# EAGLE schematic RK628H-30P-RevA (EAGLE 9.7.0)

## Sheet 1 of 7: Title Page
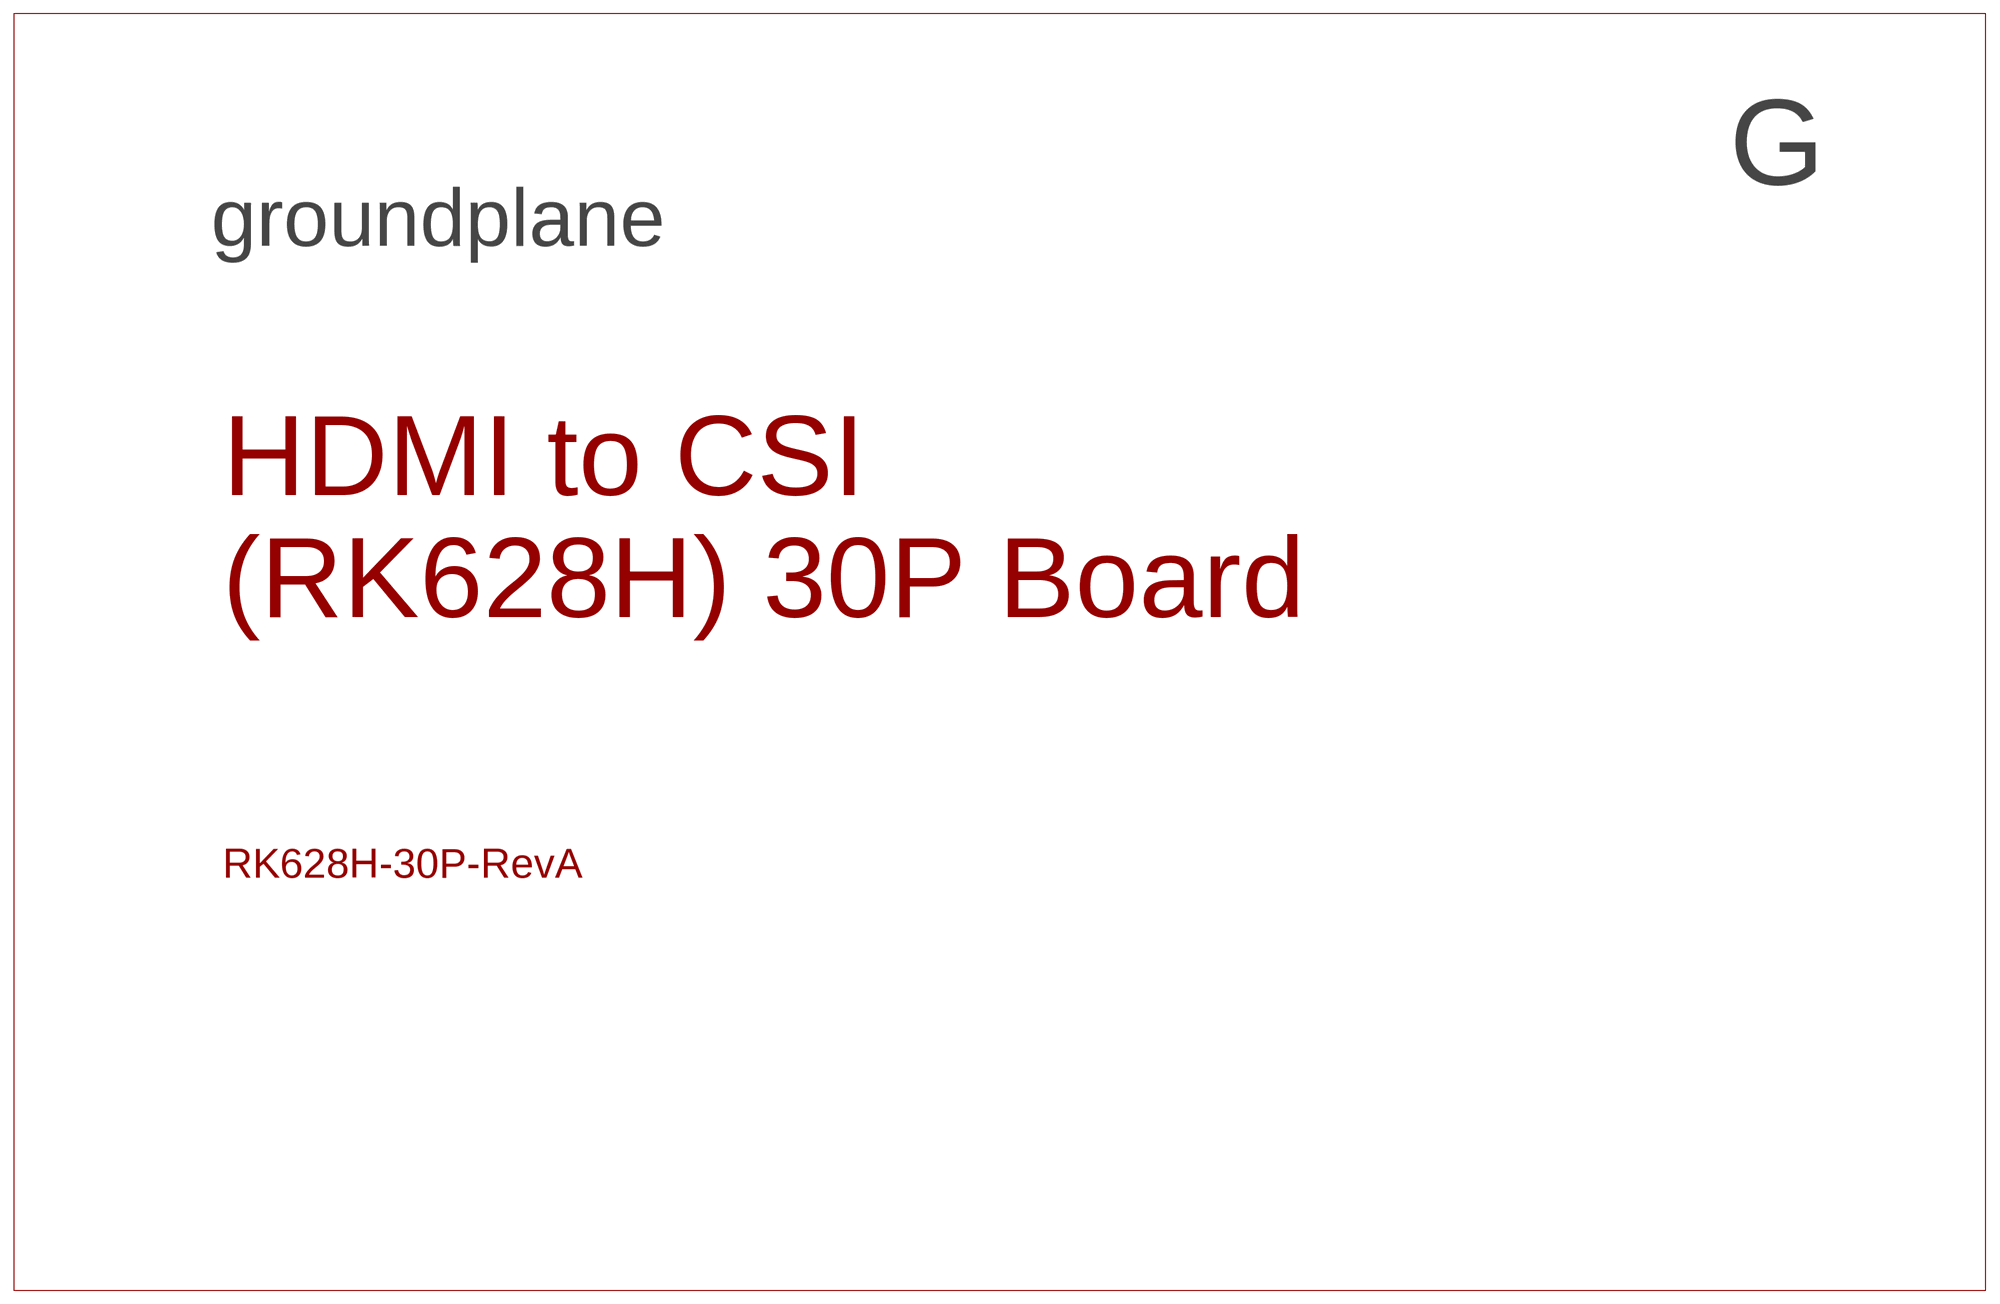
[diagram p0: schematic, sheet 1]

### Notes on the sheet
- HDMI to CSI 
  (RK628H) 30P Board

## Sheet 2 of 7: Table of Contents
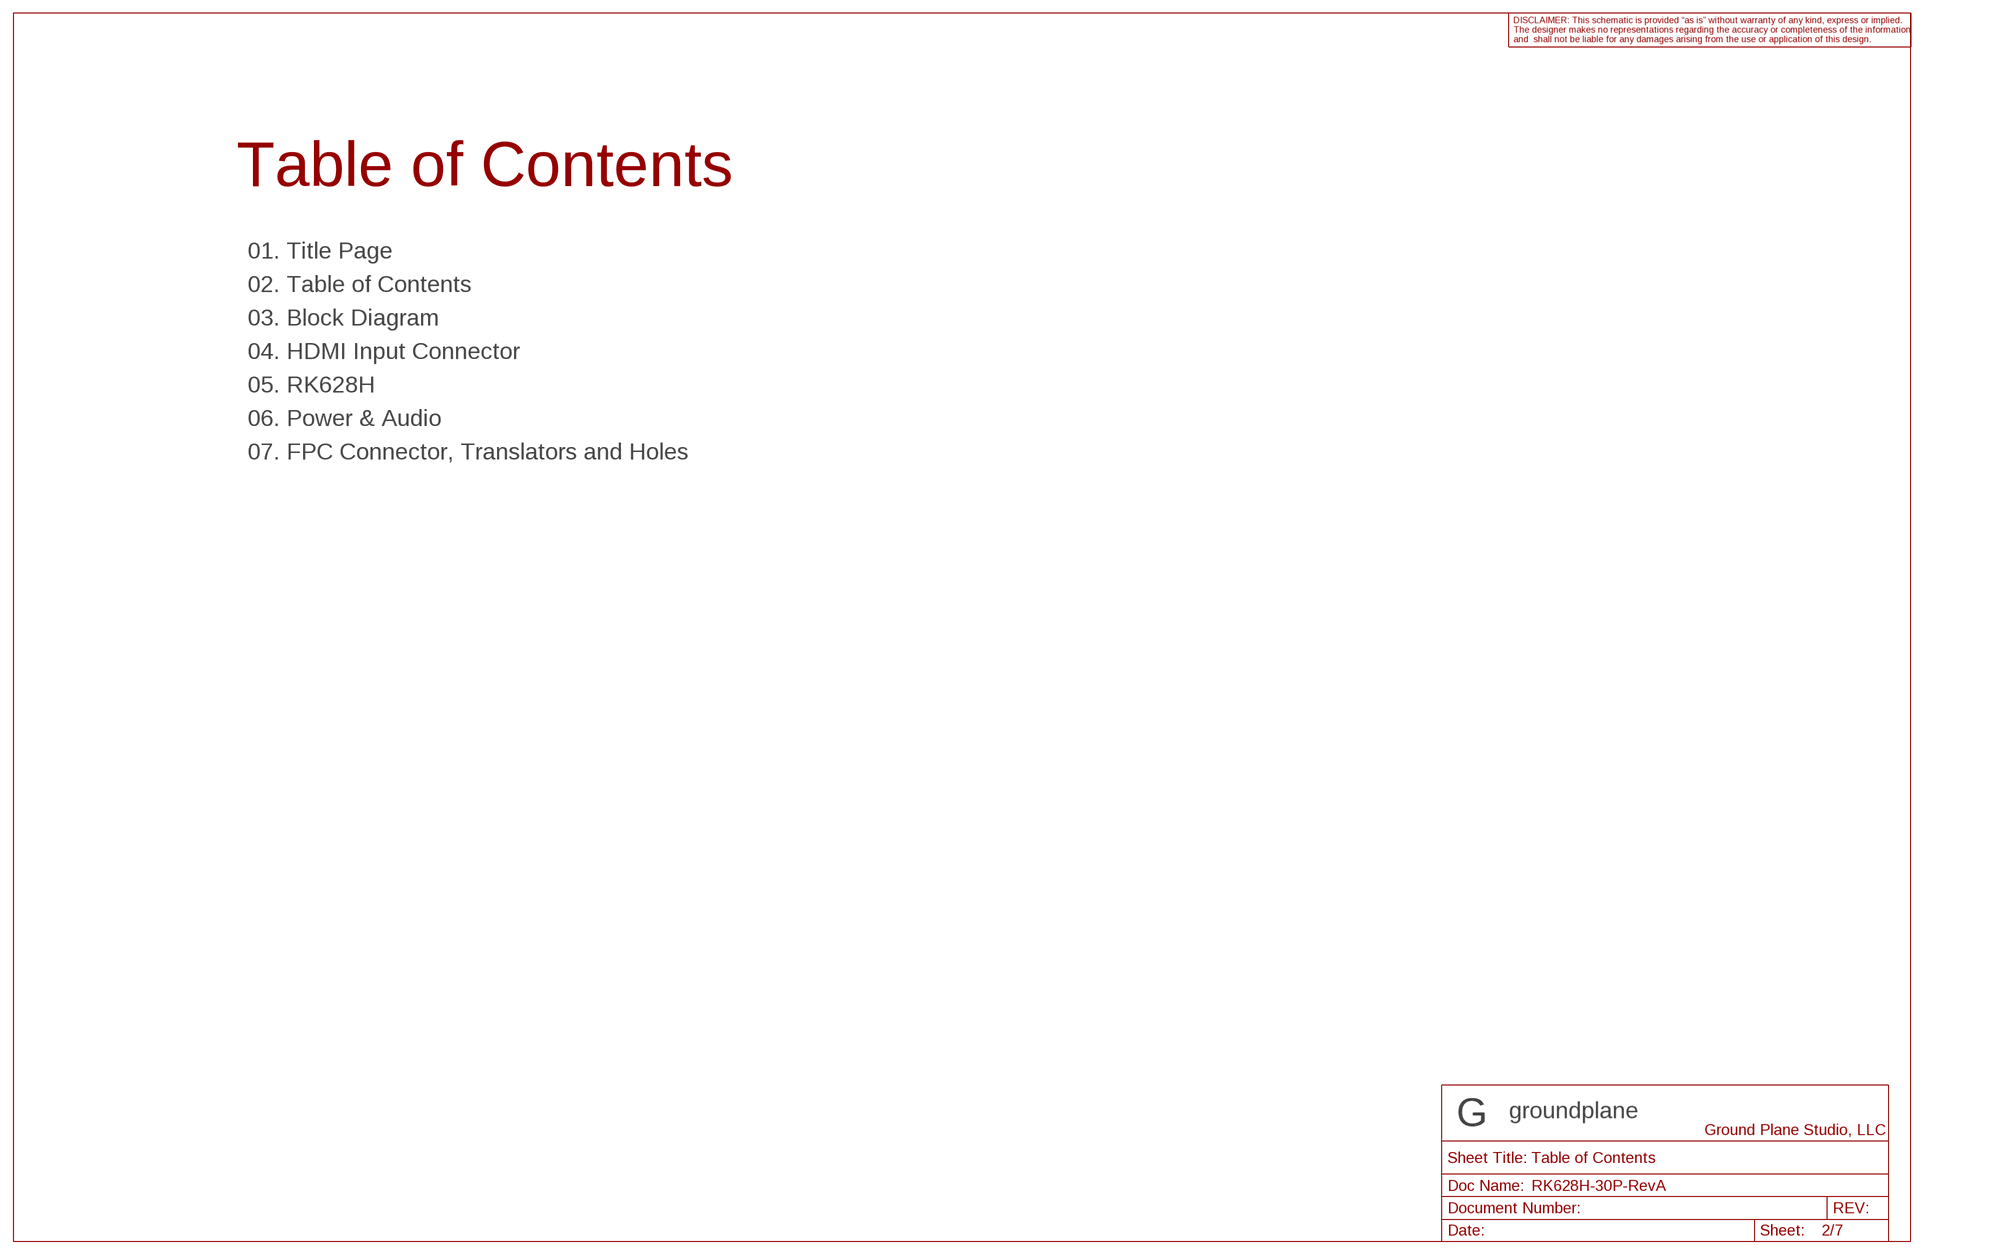
[diagram p1: schematic, sheet 2]

### Notes on the sheet
- 01. Title Page
- 02. Table of Contents
- 03. Block Diagram
- 04. HDMI Input Connector
- 05. RK628H
- 06. Power & Audio
- 07. FPC Connector, Translators and Holes

## Sheet 3 of 7: Block Diagram
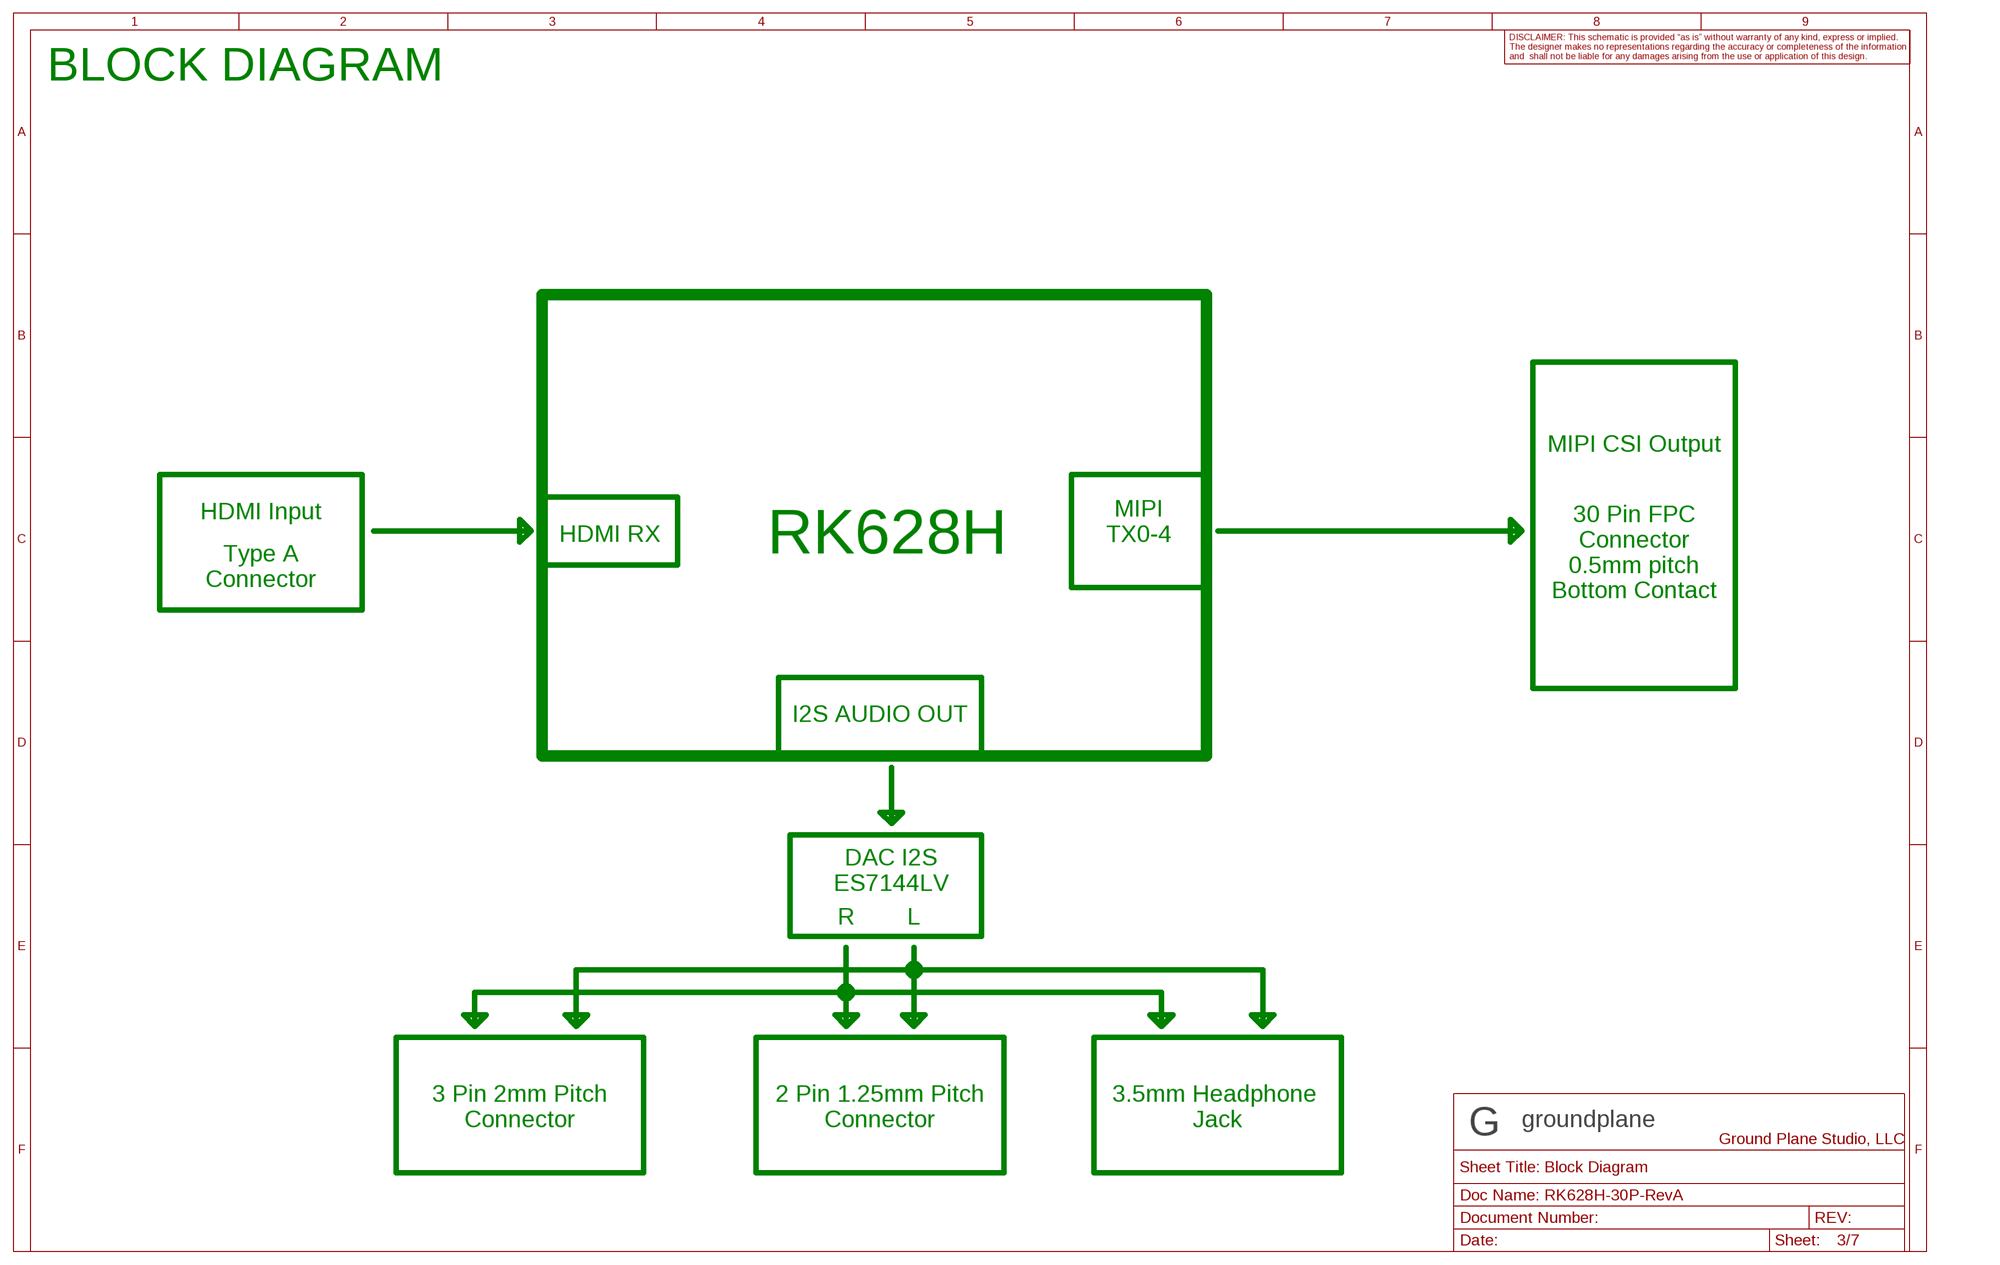
[diagram p2: schematic, sheet 3]

### Notes on the sheet
- BLOCK DIAGRAM
- MIPI CSI Output
- HDMI Input
- HDMI RX
- MIPI
  TX0-4
- RK628H
- Type A
  Connector
- 30 Pin FPC
  Connector
  0.5mm pitch
  Bottom Contact
- I2S AUDIO OUT
- DAC I2S
  ES7144LV
- R | L
- 3 Pin 2mm Pitch
  Connector
- 2 Pin 1.25mm Pitch
  Connector
- 3.5mm Headphone 
  Jack

## Sheet 4 of 7: HDMI Input Connector/TVS/Filters
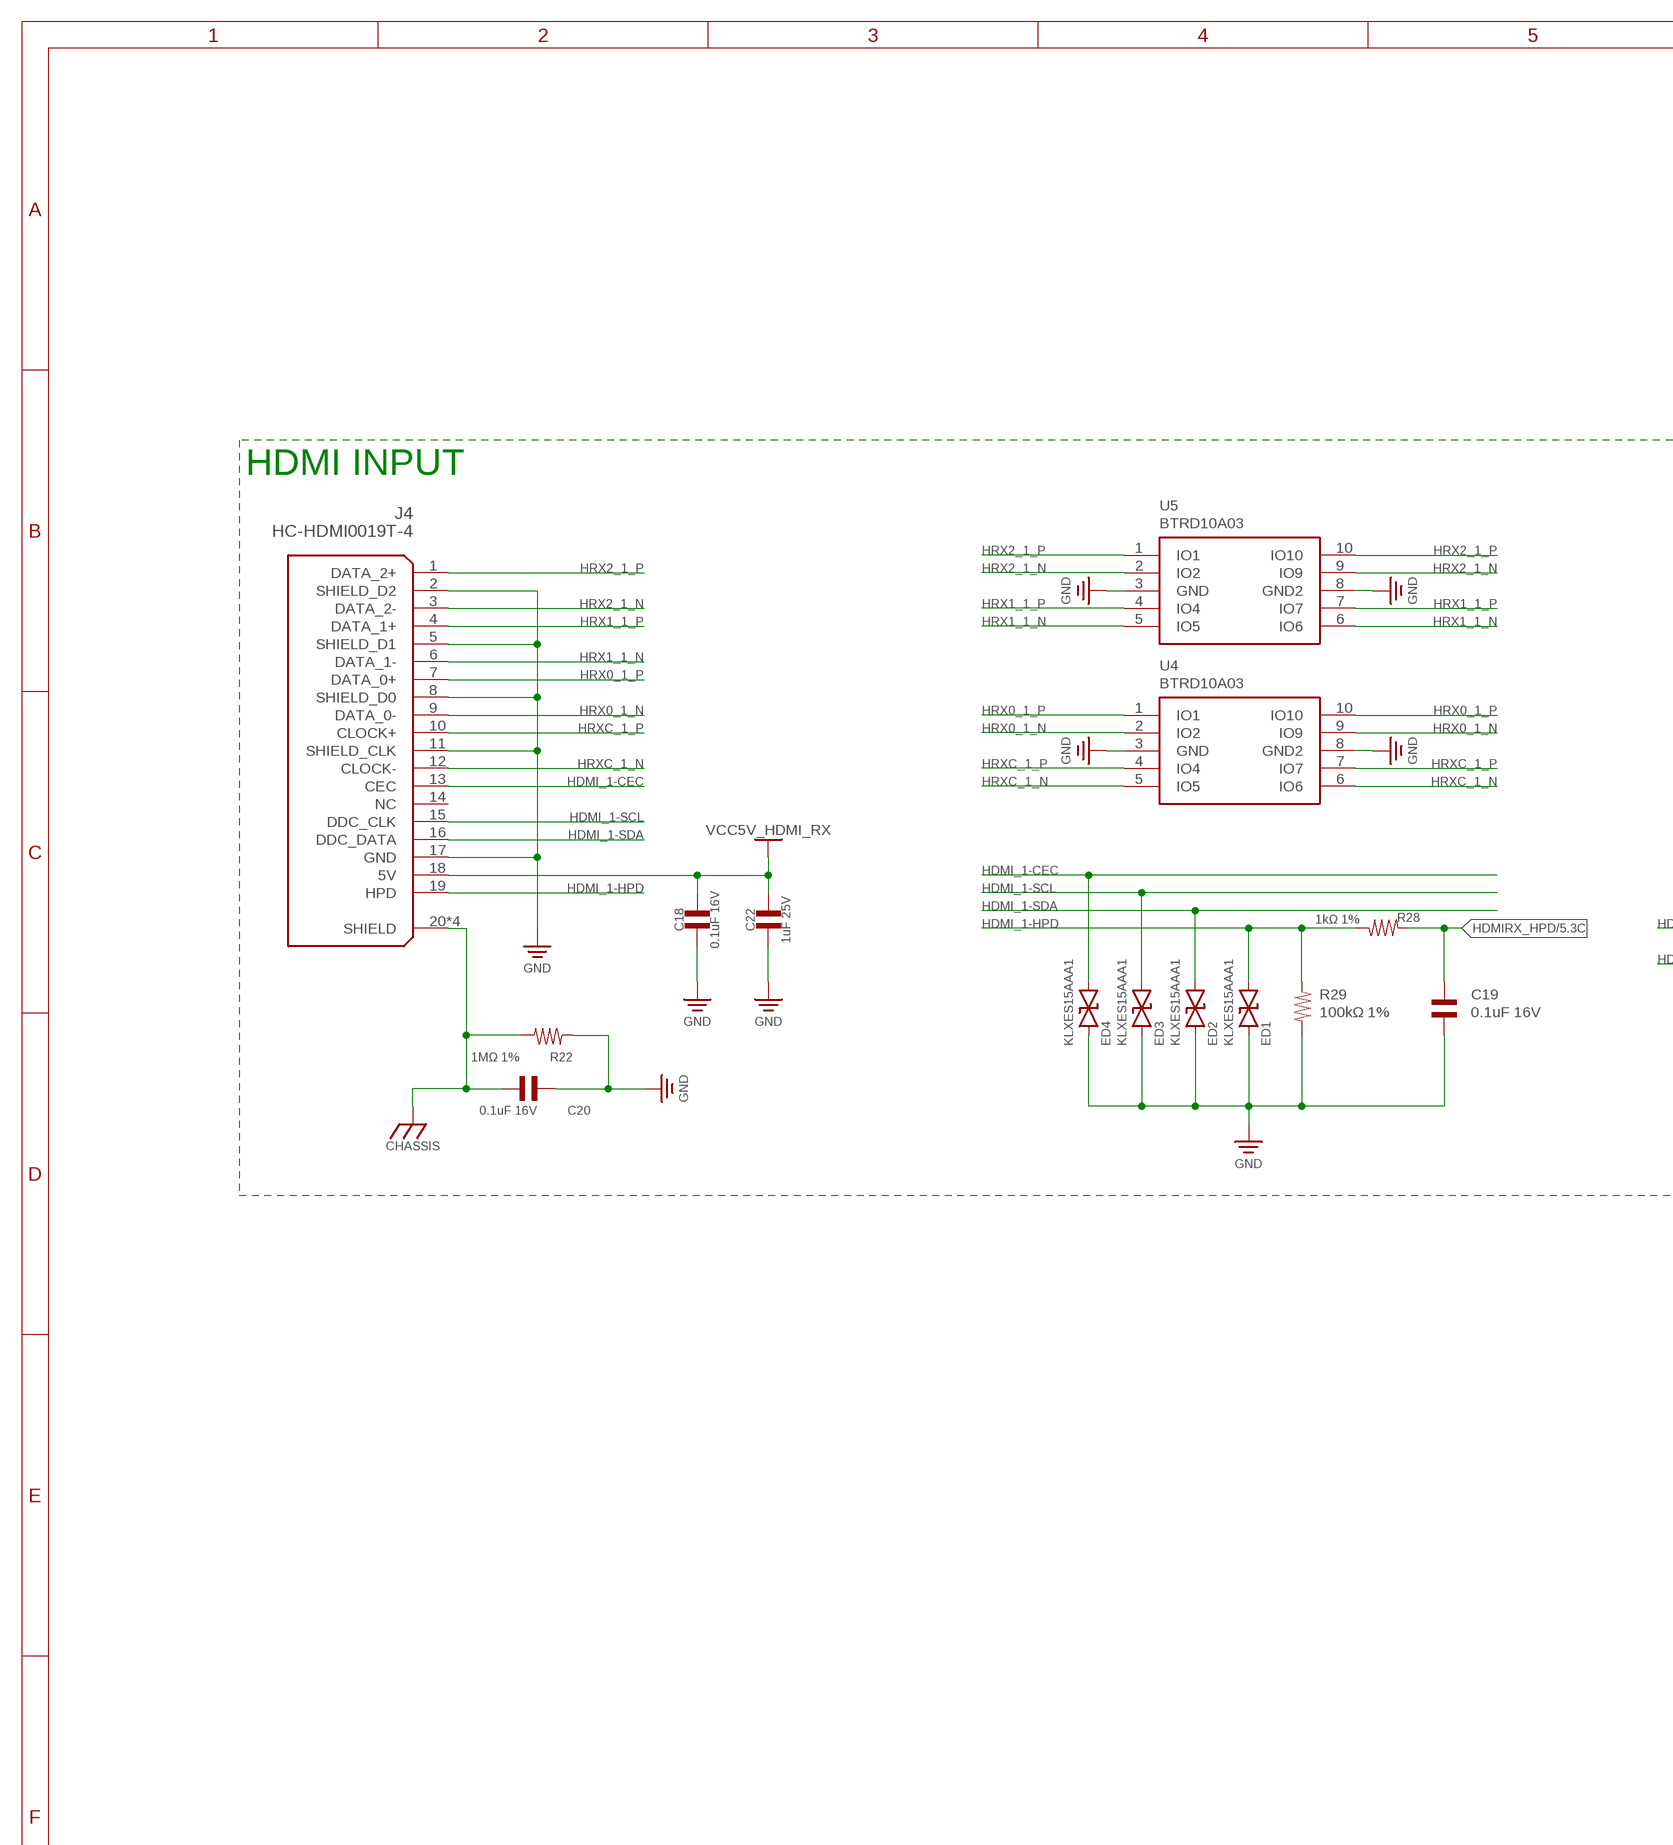
[diagram p3: schematic, sheet 4, part 1 of 2]
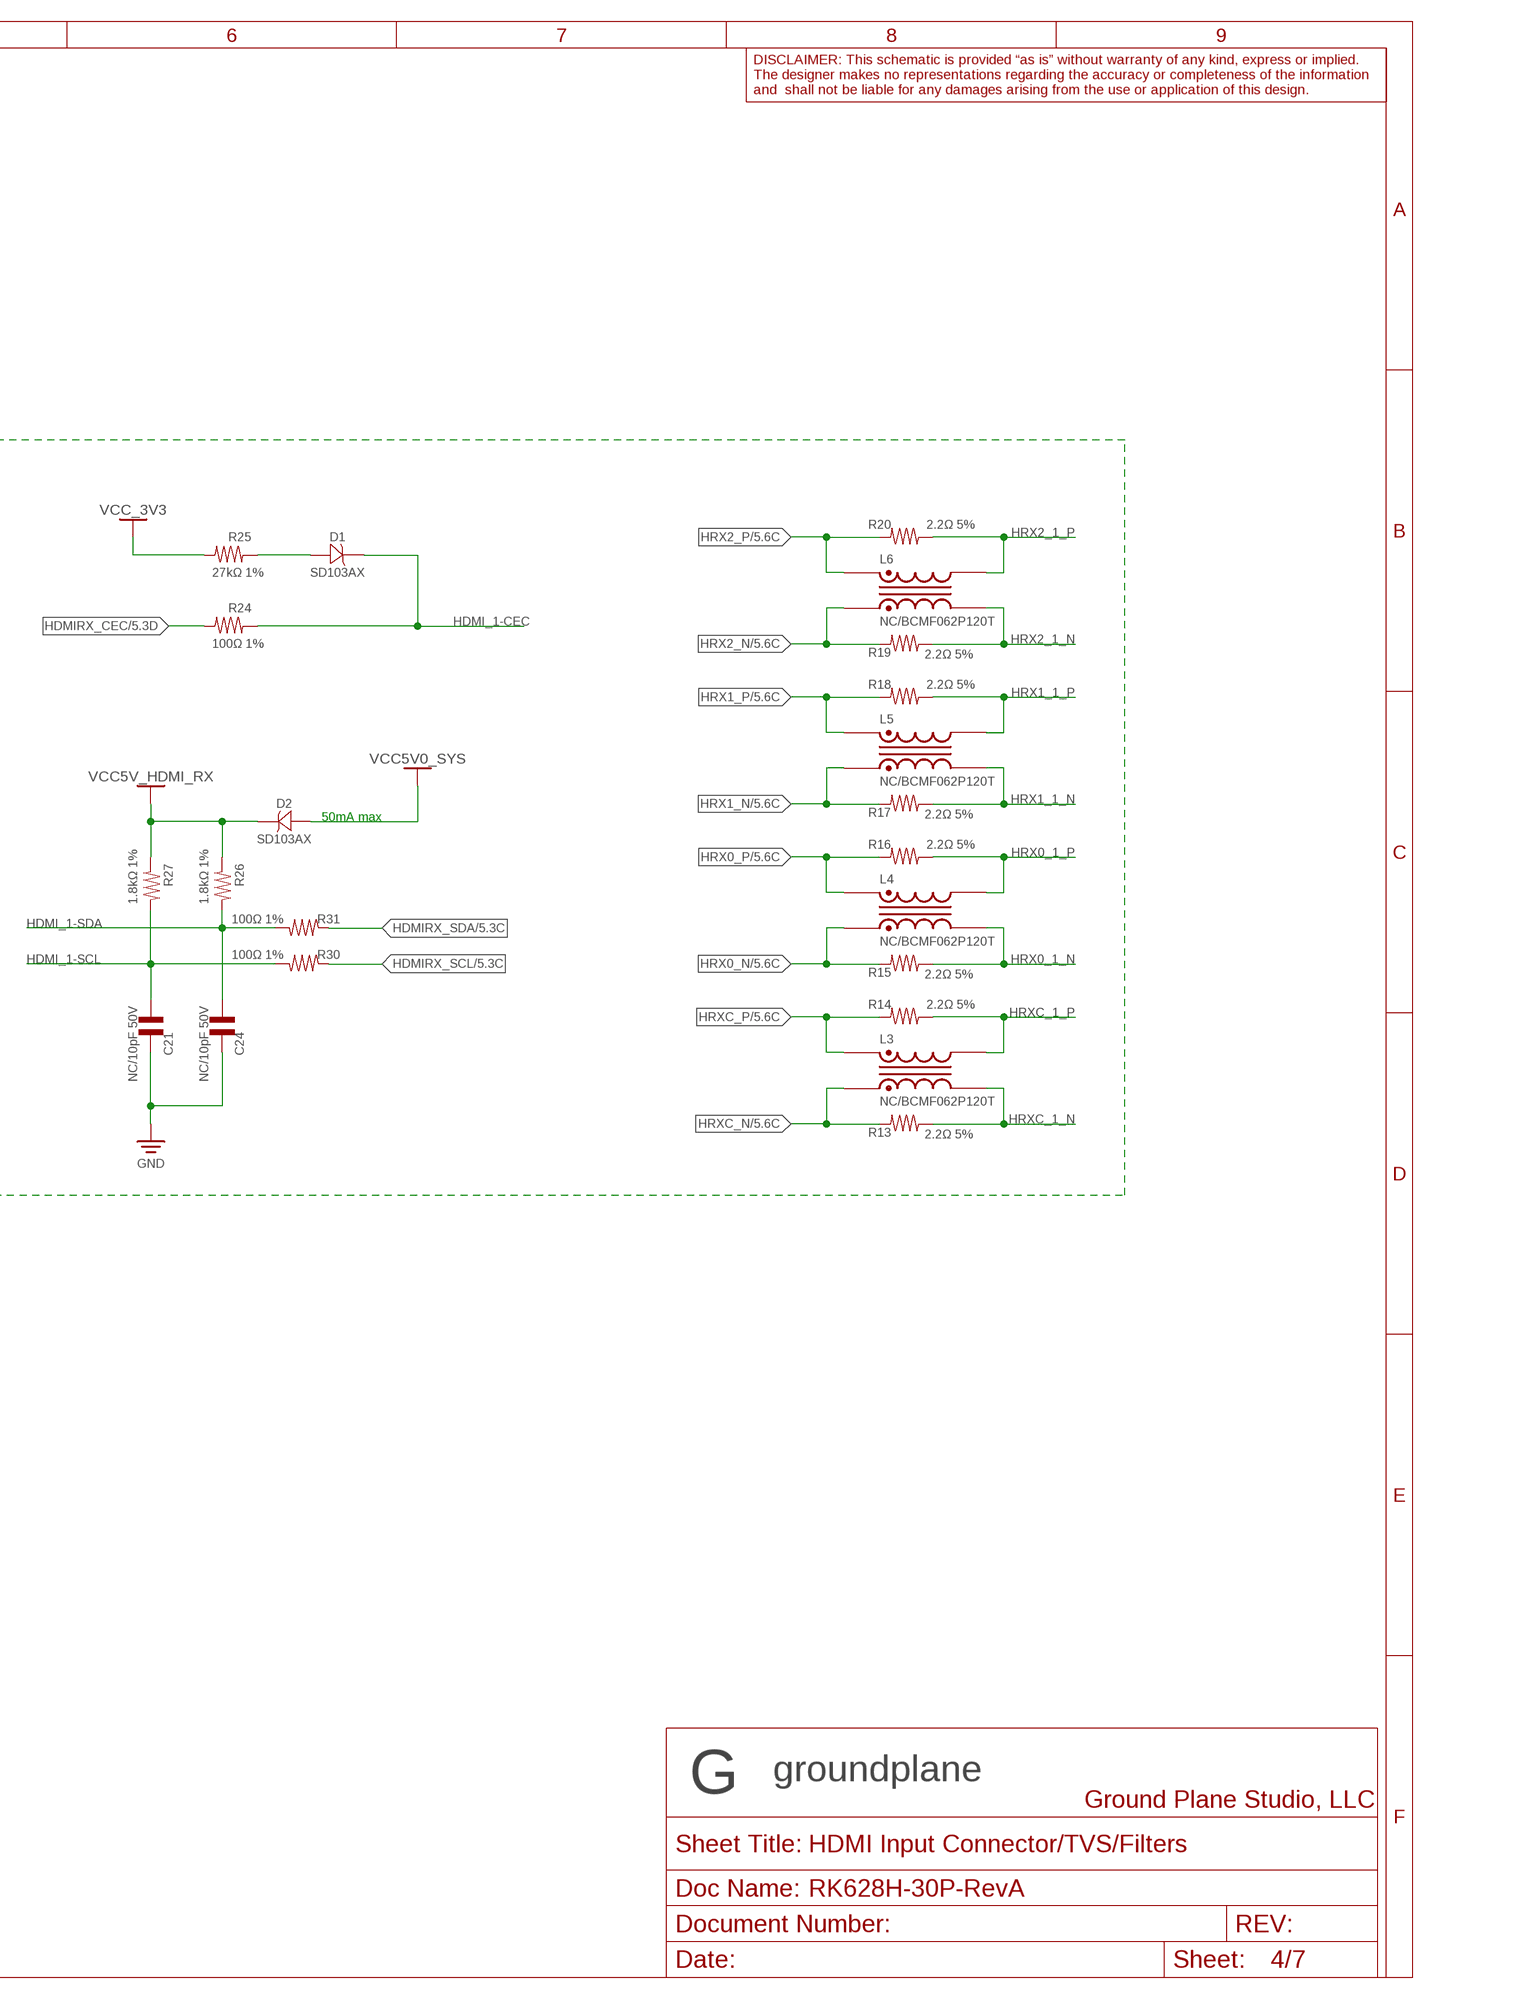
[diagram p4: schematic, sheet 4, part 2 of 2]

### Parts
C18  0.1uF 16V  CAP_0402_0.1UF_16V_X7R  [CAP_0402]
C19  0.1uF 16V  CAP_0402_0.1UF_16V_X7R  [CAP_0402]
C20  0.1uF 16V  CAP_0402_0.1UF_16V_X7R  [CAP_0402]
C21  NC/10pF 50V  CAP_0201_DNP_10PF_50V  [CAP_0201]
C22  1uF 25V  CAP_0402_1UF_25V_X5R  [CAP_0402]
C24  NC/10pF 50V  CAP_0201_DNP_10PF_50V  [CAP_0201]
D1  SD103AX  [SD103AX]
D2  SD103AX  [SD103AX]
ED1  KLXES15AAA1  TVS_ESD_1CH_BI_KLXES15AAA1  [TVS_0402]
ED2  KLXES15AAA1  TVS_ESD_1CH_BI_KLXES15AAA1  [TVS_0402]
ED3  KLXES15AAA1  TVS_ESD_1CH_BI_KLXES15AAA1  [TVS_0402]
ED4  KLXES15AAA1  TVS_ESD_1CH_BI_KLXES15AAA1  [TVS_0402]
J4  HC-HDMI0019T-4  CONN_HDMI_A_HC-HDMI0019T-4  [CONN_HDMI_A_SMT_RA_HC-HDMI0019T-4]
L3  NC/BCMF062P120T  BCMF062P120T_BCMF062P120T_NC  [BCMF062P120T]
L4  NC/BCMF062P120T  BCMF062P120T_BCMF062P120T_NC  [BCMF062P120T]
L5  NC/BCMF062P120T  BCMF062P120T_BCMF062P120T_NC  [BCMF062P120T]
L6  NC/BCMF062P120T  BCMF062P120T_BCMF062P120T_NC  [BCMF062P120T]
R13  2.2Ω 5%  RES_0201_2R2_5%  [RES_0201]
R14  2.2Ω 5%  RES_0201_2R2_5%  [RES_0201]
R15  2.2Ω 5%  RES_0201_2R2_5%  [RES_0201]
R16  2.2Ω 5%  RES_0201_2R2_5%  [RES_0201]
R17  2.2Ω 5%  RES_0201_2R2_5%  [RES_0201]
R18  2.2Ω 5%  RES_0201_2R2_5%  [RES_0201]
R19  2.2Ω 5%  RES_0201_2R2_5%  [RES_0201]
R20  2.2Ω 5%  RES_0201_2R2_5%  [RES_0201]
R22  1MΩ 1%  RES_0402_1M_1%  [RES_0402]
R24  100Ω 1%  RES_0402_100R_1%  [RES_0402]
R25  27kΩ 1%  RES_0402_27K_1%  [RES_0402]
R26  1.8kΩ 1%  RES_0402_1K8_1%  [RES_0402]
R27  1.8kΩ 1%  RES_0402_1K8_1%  [RES_0402]
R28  1kΩ 1%  RES_0402_1K_1%  [RES_0402]
R29  100kΩ 1%  RES_0402_100K_1%_1/16W  [RES_0402]
R30  100Ω 1%  RES_0402_100R_1%  [RES_0402]
R31  100Ω 1%  RES_0402_100R_1%  [RES_0402]
U4  BTRD10A03  TVS_ESD_4CH_10P_PASS_THRU_BTRD10A03  [DFN2510-10]
U5  BTRD10A03  TVS_ESD_4CH_10P_PASS_THRU_BTRD10A03  [DFN2510-10]

### Nets
CGND: C20.2 J4.20(SHIELD) J4.21(SHIELD) J4.22(SHIELD) J4.23(SHIELD) R22.1 ; supply symbol labelled CHASSIS ; also sheet 7
GND: C18.1 C19.1 C20.1 C21.1 C22.1 C24.1 ED1.1 ED2.1 ED3.1 ED4.1 J4.2(SHIELD_D2) J4.5(SHIELD_D1) J4.8(SHIELD_D0) J4.11(SHIELD_CLK) J4.17(GND) R22.2 R29.1 U4.3(GND) U4.8(GND2) U5.3(GND) U5.8(GND2) ; also sheet 5,6,7
HDMI_1-CEC: D1.C ED4.2 J4.13(CEC) R24.1
HDMI_1-HPD: ED1.2 J4.19(HPD) R28.1 R29.2
HDMI_1-SCL: C21.2 ED3.2 J4.15(DDC_CLK) R27.2 R30.1
HDMI_1-SDA: C24.2 ED2.2 J4.16(DDC_DATA) R26.2 R31.1
HDMIRX_CEC: R24.2 ; also sheet 5
HDMIRX_HPD: C19.2 R28.2 ; also sheet 5
HDMIRX_SCL: R30.2 ; also sheet 5
HDMIRX_SDA: R31.2 ; also sheet 5
HRX0_1_N [hdmi_diff]: J4.9(DATA_0-) L4.3 R15.1 U4.2(IO2) U4.9(IO9)
HRX0_1_P [hdmi_diff]: J4.7(DATA_0+) L4.4 R16.1 U4.1(IO1) U4.10(IO10)
HRX0_N [hdmi_diff]: L4.2 R15.2 ; also sheet 5
HRX0_P [hdmi_diff]: L4.1 R16.2 ; also sheet 5
HRX1_1_N [hdmi_diff]: J4.6(DATA_1-) L5.3 R17.1 U5.5(IO5) U5.6(IO6)
HRX1_1_P [hdmi_diff]: J4.4(DATA_1+) L5.4 R18.1 U5.4(IO4) U5.7(IO7)
HRX1_N [hdmi_diff]: L5.2 R17.2 ; also sheet 5
HRX1_P [hdmi_diff]: L5.1 R18.2 ; also sheet 5
HRX2_1_N [hdmi_diff]: J4.3(DATA_2-) L6.3 R19.1 U5.2(IO2) U5.9(IO9)
HRX2_1_P [hdmi_diff]: J4.1(DATA_2+) L6.4 R20.1 U5.1(IO1) U5.10(IO10)
HRX2_N [hdmi_diff]: L6.2 R19.2 ; also sheet 5
HRX2_P [hdmi_diff]: L6.1 R20.2 ; also sheet 5
HRXC_1_N [hdmi_diff]: J4.12(CLOCK-) L3.3 R13.1 U4.5(IO5) U4.6(IO6)
HRXC_1_P [hdmi_diff]: J4.10(CLOCK+) L3.4 R14.1 U4.4(IO4) U4.7(IO7)
HRXC_N [hdmi_diff]: L3.2 R13.2 ; also sheet 5
HRXC_P [hdmi_diff]: L3.1 R14.2 ; also sheet 5
N$11: D1.A R25.1
VCC5V0_SYS: D2.A ; also sheet 6,7
VCC5V_HDMI_RX: C18.2 C22.2 D2.C J4.18(5V) R26.1 R27.1 ; also sheet 7
VCC_3V3: R25.2 ; also sheet 5,6,7
Unconnected: J4.14(NC)

### Notes on the sheet
- HDMI INPUT
- 50mA max

## Sheet 5 of 7: HDMI TO CSI - RK628H
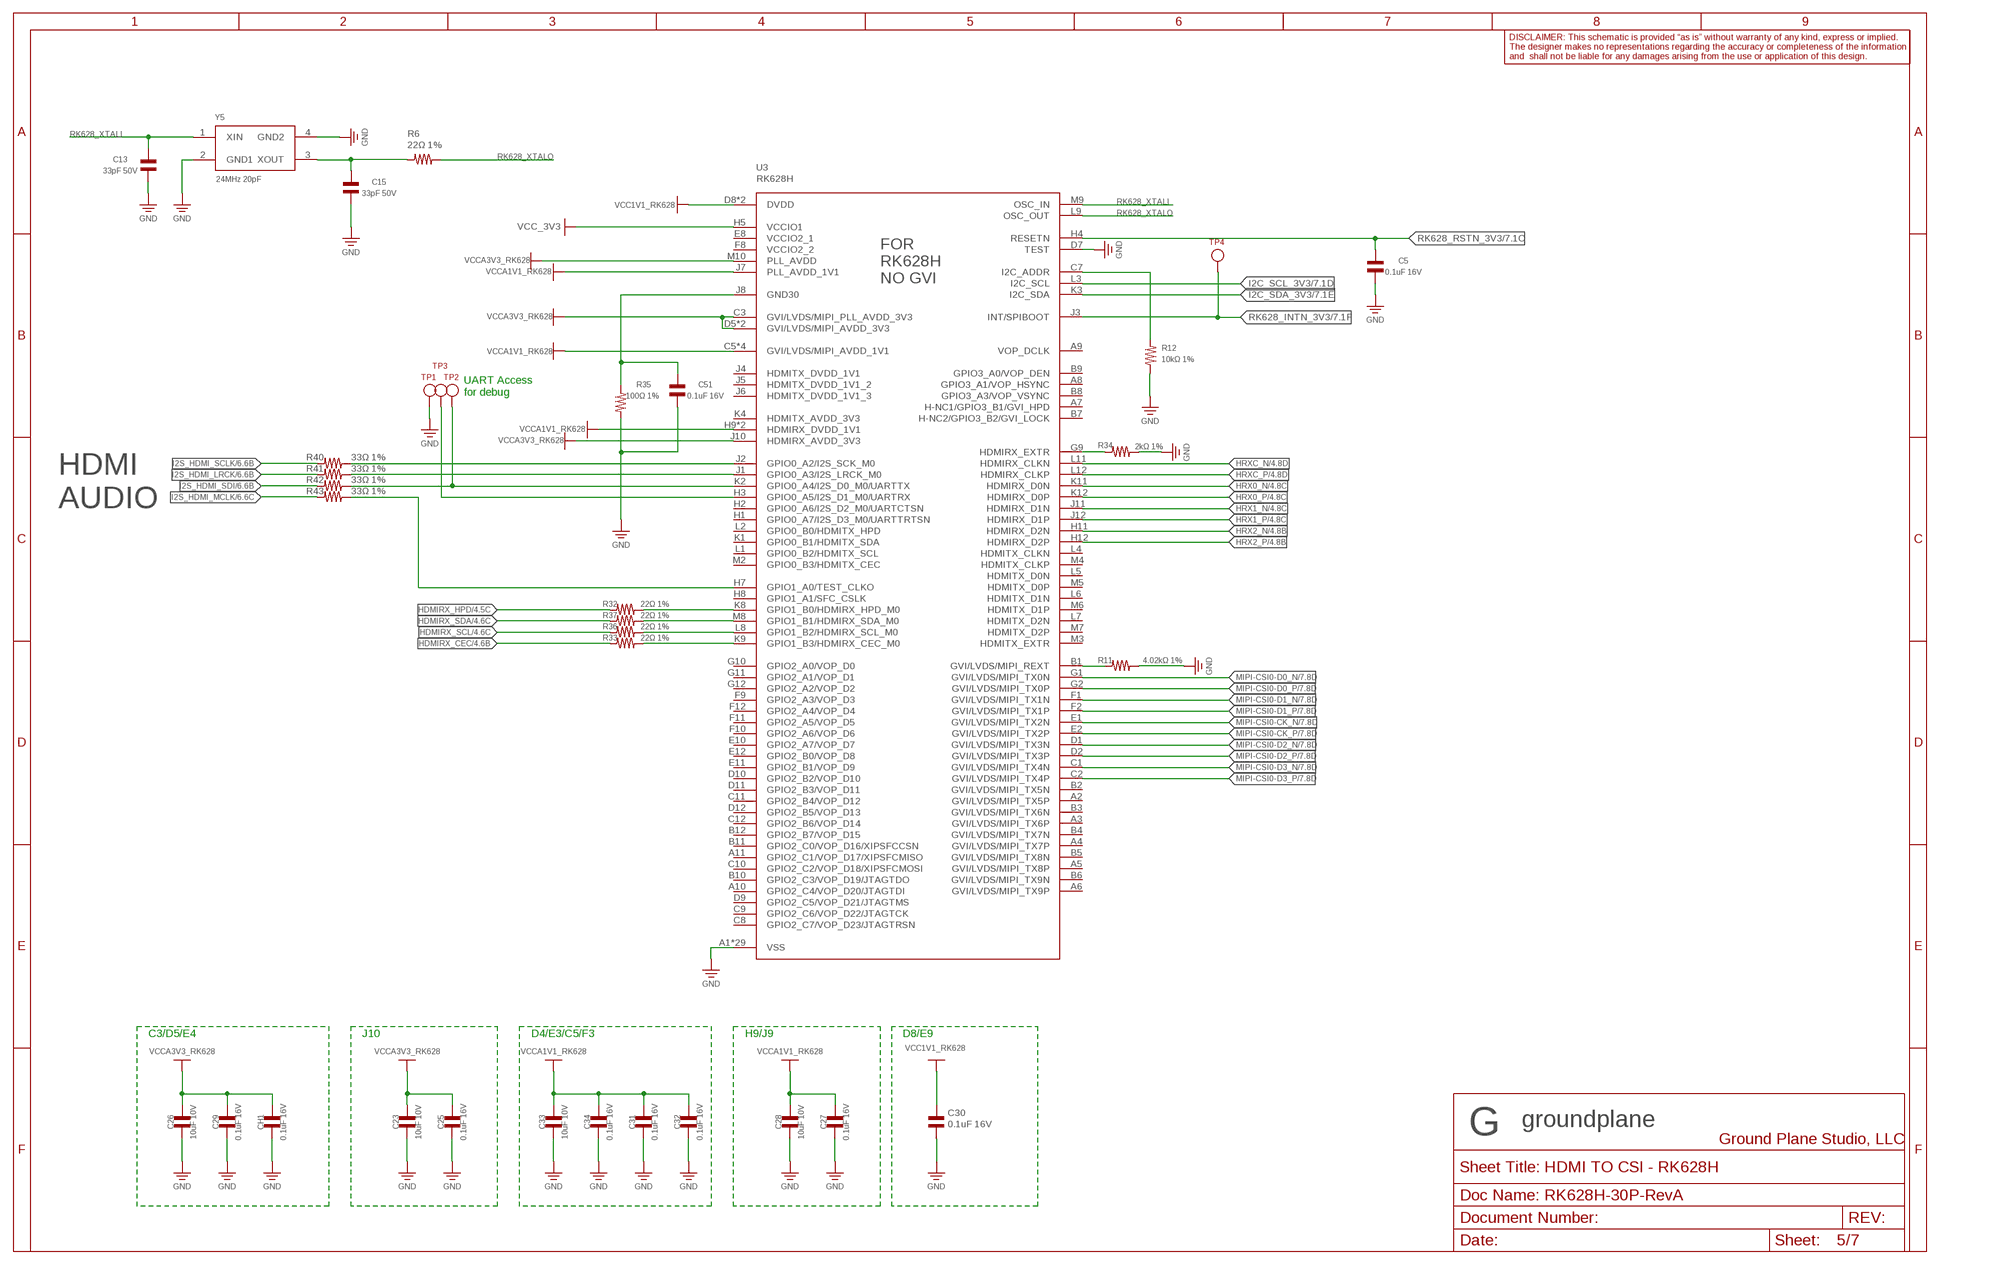
[diagram p5: schematic, sheet 5]

### Parts
C5  0.1uF 16V  CAP_0402_0.1UF_16V_X7R  [CAP_0402]
C13  33pF 50V  CAP_0402_33PF_50V  [CAP_0402]
C15  33pF 50V  CAP_0402_33PF_50V  [CAP_0402]
C23  10uF 10V  CAP_0402_10UF_10V_X5R  [CAP_0402]
C25  0.1uF 16V  CAP_0402_0.1UF_16V_X7R  [CAP_0402]
C26  10uF 10V  CAP_0402_10UF_10V_X5R  [CAP_0402]
C27  0.1uF 16V  CAP_0402_0.1UF_16V_X7R  [CAP_0402]
C28  10uF 10V  CAP_0402_10UF_10V_X5R  [CAP_0402]
C29  0.1uF 16V  CAP_0402_0.1UF_16V_X7R  [CAP_0402]
C30  0.1uF 16V  CAP_0402_0.1UF_16V_X7R  [CAP_0402]
C31  0.1uF 16V  CAP_0402_0.1UF_16V_X7R  [CAP_0402]
C32  0.1uF 16V  CAP_0402_0.1UF_16V_X7R  [CAP_0402]
C33  10uF 10V  CAP_0402_10UF_10V_X5R  [CAP_0402]
C34  0.1uF 16V  CAP_0402_0.1UF_16V_X7R  [CAP_0402]
C51  0.1uF 16V  CAP_0402_0.1UF_16V_X7R  [CAP_0402]
CH1  0.1uF 16V  CAP_0402_0.1UF_16V_X7R  [CAP_0402]
R6  22Ω 1%  RES_0402_22R_1%  [RES_0402]
R11  4.02kΩ 1%  RES_0402_4K02_1%  [RES_0402]
R12  10kΩ 1%  RES_0402_10K_1%_1/16W  [RES_0402]
R32  22Ω 1%  RES_0402_22R_1%  [RES_0402]
R33  22Ω 1%  RES_0402_22R_1%  [RES_0402]
R34  2kΩ 1%  RES_0402_2K_1%_1/16W  [RES_0402]
R35  100Ω 1%  RES_0402_100R_1%  [RES_0402]
R36  22Ω 1%  RES_0402_22R_1%  [RES_0402]
R37  22Ω 1%  RES_0402_22R_1%  [RES_0402]
R40  33Ω 1%  RES_0402_33R_1%  [RES_0402]
R41  33Ω 1%  RES_0402_33R_1%  [RES_0402]
R42  33Ω 1%  RES_0402_33R_1%  [RES_0402]
R43  33Ω 1%  RES_0402_33R_1%  [RES_0402]
TP1  TEST_POINT_1MM  TESTPOINT_0.5MM  [TEST_POINT_0.5MM]
TP2  TEST_POINT_1MM  TESTPOINT_0.5MM  [TEST_POINT_0.5MM]
TP3  TEST_POINT_1MM  TESTPOINT_0.5MM  [TEST_POINT_0.5MM]
TP4  TEST_POINT_1MM_0.5MM  [TEST_POINT_0.5MM]
U3  RK628H  IF_VIDEO_BRIDGE_RK628F/H_RK628H  [WBBGA144_8X8MM]
Y5  24MHz 20pF  CRYSTAL_SMD2016-4P_24MHZ_20PF_10PPM_T201624MLBDE2X  [CRYSTAL_SMD2016-4P]

### Nets
GND: C5.1 C13.1 C15.1 C23.1 C25.1 C26.1 C27.1 C28.1 C29.1 C30.2 C31.1 C32.1 C33.1 C34.1 C51.2 CH1.1 R11.1 R12.1 R34.1 R35.2 TP1.P$1 U3.A1(VSS) U3.A12(VSS) U3.C4(VSS) U3.C6(VSS) U3.D3(VSS) U3.D6(VSS) U3.D7(TEST) U3.E5(VSS) U3.E6(VSS) U3.E7(VSS) U3.F4(VSS) U3.F5(VSS) U3.F6(VSS) U3.F7(VSS) U3.G3(VSS) U3.G4(VSS) U3.G5(VSS) U3.G6(VSS) U3.G7(VSS) U3.G8(VSS) U3.H6(VSS) U3.H10(VSS) U3.K5(VSS) U3.K6(VSS) U3.K7(VSS) U3.K10(VSS) U3.L10(VSS) U3.M1(VSS) U3.M11(VSS) U3.M12(VSS) Y5.2(GND1) Y5.4(GND2) ; also sheet 4,6,7
HDMIRX_CEC: R33.2 ; also sheet 4
HDMIRX_HPD: R32.2 ; also sheet 4
HDMIRX_SCL: R36.2 ; also sheet 4
HDMIRX_SDA: R37.2 ; also sheet 4
HRX0_N [hdmi_diff]: U3.K11(HDMIRX_D0N) ; also sheet 4
HRX0_P [hdmi_diff]: U3.K12(HDMIRX_D0P) ; also sheet 4
HRX1_N [hdmi_diff]: U3.J11(HDMIRX_D1N) ; also sheet 4
HRX1_P [hdmi_diff]: U3.J12(HDMIRX_D1P) ; also sheet 4
HRX2_N [hdmi_diff]: U3.H11(HDMIRX_D2N) ; also sheet 4
HRX2_P [hdmi_diff]: U3.H12(HDMIRX_D2P) ; also sheet 4
HRXC_N [hdmi_diff]: U3.L11(HDMIRX_CLKN) ; also sheet 4
HRXC_P [hdmi_diff]: U3.L12(HDMIRX_CLKP) ; also sheet 4
I2C_SCL_3V3: U3.L3(I2C_SCL) ; also sheet 7
I2C_SDA_3V3: U3.K3(I2C_SDA) ; also sheet 7
I2S_HDMI_LRCK [50 ohm]: R41.2 ; also sheet 6
I2S_HDMI_MCLK [50 ohm]: R43.2 ; also sheet 6
I2S_HDMI_SCLK [50 ohm]: R40.2 ; also sheet 6
I2S_HDMI_SDI: R42.2 ; also sheet 6
MIPI-CSI0-CK_N [hdmi_diff]: U3.E1(GVI/LVDS/MIPI_TX2N) ; also sheet 7
MIPI-CSI0-CK_P [hdmi_diff]: U3.E2(GVI/LVDS/MIPI_TX2P) ; also sheet 7
MIPI-CSI0-D0_N [hdmi_diff]: U3.G1(GVI/LVDS/MIPI_TX0N) ; also sheet 7
MIPI-CSI0-D0_P [hdmi_diff]: U3.G2(GVI/LVDS/MIPI_TX0P) ; also sheet 7
MIPI-CSI0-D1_N [hdmi_diff]: U3.F1(GVI/LVDS/MIPI_TX1N) ; also sheet 7
MIPI-CSI0-D1_P [hdmi_diff]: U3.F2(GVI/LVDS/MIPI_TX1P) ; also sheet 7
MIPI-CSI0-D2_N [hdmi_diff]: U3.D1(GVI/LVDS/MIPI_TX3N) ; also sheet 7
MIPI-CSI0-D2_P [hdmi_diff]: U3.D2(GVI/LVDS/MIPI_TX3P) ; also sheet 7
MIPI-CSI0-D3_N [hdmi_diff]: U3.C1(GVI/LVDS/MIPI_TX4N) ; also sheet 7
MIPI-CSI0-D3_P [hdmi_diff]: U3.C2(GVI/LVDS/MIPI_TX4P) ; also sheet 7
N$2: C15.2 R6.2 Y5.3(XOUT)
N$15: R40.1 U3.J2(GPIO0_A2/I2S_SCK_M0)
N$16: R41.1 U3.J1(GPIO0_A3/I2S_LRCK_M0)
N$18: R42.1 TP2.P$1 U3.K2(GPIO0_A4/I2S_D0_M0/UARTTX)
N$22: R43.1 U3.H7(GPIO1_A0/TEST_CLKO)
N$24: R11.2 U3.B1(GVI/LVDS/MIPI_REXT)
N$25: R34.2 U3.G9(HDMIRX_EXTR)
N$94: R32.1 U3.K8(GPIO1_B0/HDMIRX_HPD_M0)
N$95: R37.1 U3.M8(GPIO1_B1/HDMIRX_SDA_M0)
N$96: R36.1 U3.L8(GPIO1_B2/HDMIRX_SCL_M0)
N$97: R33.1 U3.K9(GPIO1_B3/HDMIRX_CEC_M0)
N$99: C51.1 R35.1 U3.J8(GND30)
N$108: TP3.P$1 U3.H3(GPIO0_A5/I2S_D1_M0/UARTRX)
N$110: R12.2 U3.C7(I2C_ADDR)
RK628_INTN_3V3: TP4.P$1 U3.J3(INT/SPIBOOT) ; also sheet 7
RK628_RSTN_3V3: C5.2 U3.H4(RESETN) ; also sheet 7
RK628_XTALI: C13.2 U3.M9(OSC_IN) Y5.1(XIN)
RK628_XTALO: R6.1 U3.L9(OSC_OUT)
VCC1V1_RK628: C30.1 U3.D8(DVDD) U3.E9(DVDD) ; also sheet 6
VCC_3V3: U3.H5(VCCIO1) ; also sheet 4,6,7
VCCA1V1_RK628: C27.2 C28.2 C31.2 C32.2 C33.2 C34.2 U3.C5(GVI/LVDS/MIPI_AVDD_1V1) U3.D4(GVI/LVDS/MIPI_AVDD_1V1) U3.E3(GVI/LVDS/MIPI_AVDD_1V1) U3.F3(GVI/LVDS/MIPI_AVDD_1V1) U3.H9(HDMIRX_DVDD_1V1) U3.J7(PLL_AVDD_1V1) U3.J9(HDMIRX_DVDD_1V1) ; also sheet 6
VCCA3V3_RK628: C23.2 C25.2 C26.2 C29.2 CH1.2 U3.C3(GVI/LVDS/MIPI_PLL_AVDD_3V3) U3.D5(GVI/LVDS/MIPI_AVDD_3V3) U3.E4(GVI/LVDS/MIPI_AVDD_3V3) U3.J10(HDMIRX_AVDD_3V3) U3.M10(PLL_AVDD) ; also sheet 6
Unconnected: U3.A2(GVI/LVDS/MIPI_TX5P) U3.A3(GVI/LVDS/MIPI_TX6P) U3.A4(GVI/LVDS/MIPI_TX7P) U3.A5(GVI/LVDS/MIPI_TX8P) U3.A6(GVI/LVDS/MIPI_TX9P) U3.A7(H-NC1/GPIO3_B1/GVI_HPD) U3.A8(GPIO3_A1/VOP_HSYNC) U3.A9(VOP_DCLK) U3.A10(GPIO2_C4/VOP_D20/JTAGTDI) U3.A11(GPIO2_C1/VOP_D17/XIPSFCMISO) U3.B2(GVI/LVDS/MIPI_TX5N) U3.B3(GVI/LVDS/MIPI_TX6N) U3.B4(GVI/LVDS/MIPI_TX7N) U3.B5(GVI/LVDS/MIPI_TX8N) U3.B6(GVI/LVDS/MIPI_TX9N) U3.B7(H-NC2/GPIO3_B2/GVI_LOCK) U3.B8(GPIO3_A3/VOP_VSYNC) U3.B9(GPIO3_A0/VOP_DEN) U3.B10(GPIO2_C3/VOP_D19/JTAGTDO) U3.B11(GPIO2_C0/VOP_D16/XIPSFCCSN) U3.B12(GPIO2_B7/VOP_D15) U3.C8(GPIO2_C7/VOP_D23/JTAGTRSN) U3.C9(GPIO2_C6/VOP_D22/JTAGTCK) U3.C10(GPIO2_C2/VOP_D18/XIPSFCMOSI) U3.C11(GPIO2_B4/VOP_D12) U3.C12(GPIO2_B6/VOP_D14) U3.D9(GPIO2_C5/VOP_D21/JTAGTMS) U3.D10(GPIO2_B2/VOP_D10) U3.D11(GPIO2_B3/VOP_D11) U3.D12(GPIO2_B5/VOP_D13) U3.E10(GPIO2_A7/VOP_D7) U3.E11(GPIO2_B1/VOP_D9) U3.E12(GPIO2_B0/VOP_D8) U3.F9(GPIO2_A3/VOP_D3) U3.F10(GPIO2_A6/VOP_D6) U3.F11(GPIO2_A5/VOP_D5) U3.F12(GPIO2_A4/VOP_D4) U3.G10(GPIO2_A0/VOP_D0) U3.G11(GPIO2_A1/VOP_D1) U3.G12(GPIO2_A2/VOP_D2) U3.H1(GPIO0_A7/I2S_D3_M0/UARTTRTSN) U3.H2(GPIO0_A6/I2S_D2_M0/UARTCTSN) U3.H8(GPIO1_A1/SFC_CSLK) U3.K1(GPIO0_B1/HDMITX_SDA) U3.L1(GPIO0_B2/HDMITX_SCL) U3.L2(GPIO0_B0/HDMITX_HPD) U3.L4(HDMITX_CLKN) U3.L5(HDMITX_D0N) U3.L6(HDMITX_D1N) U3.L7(HDMITX_D2N) U3.M2(GPIO0_B3/HDMITX_CEC) U3.M3(HDMITX_EXTR) U3.M4(HDMITX_CLKP) U3.M5(HDMITX_D0P) U3.M6(HDMITX_D1P) U3.M7(HDMITX_D2P)

### Notes on the sheet
- UART Access
  for debug
- HDMI 
  AUDIO
- C3/D5/E4 | J10 | D4/E3/C5/F3 | H9/J9 | D8/E9

## Sheet 6 of 7: Power & Audio
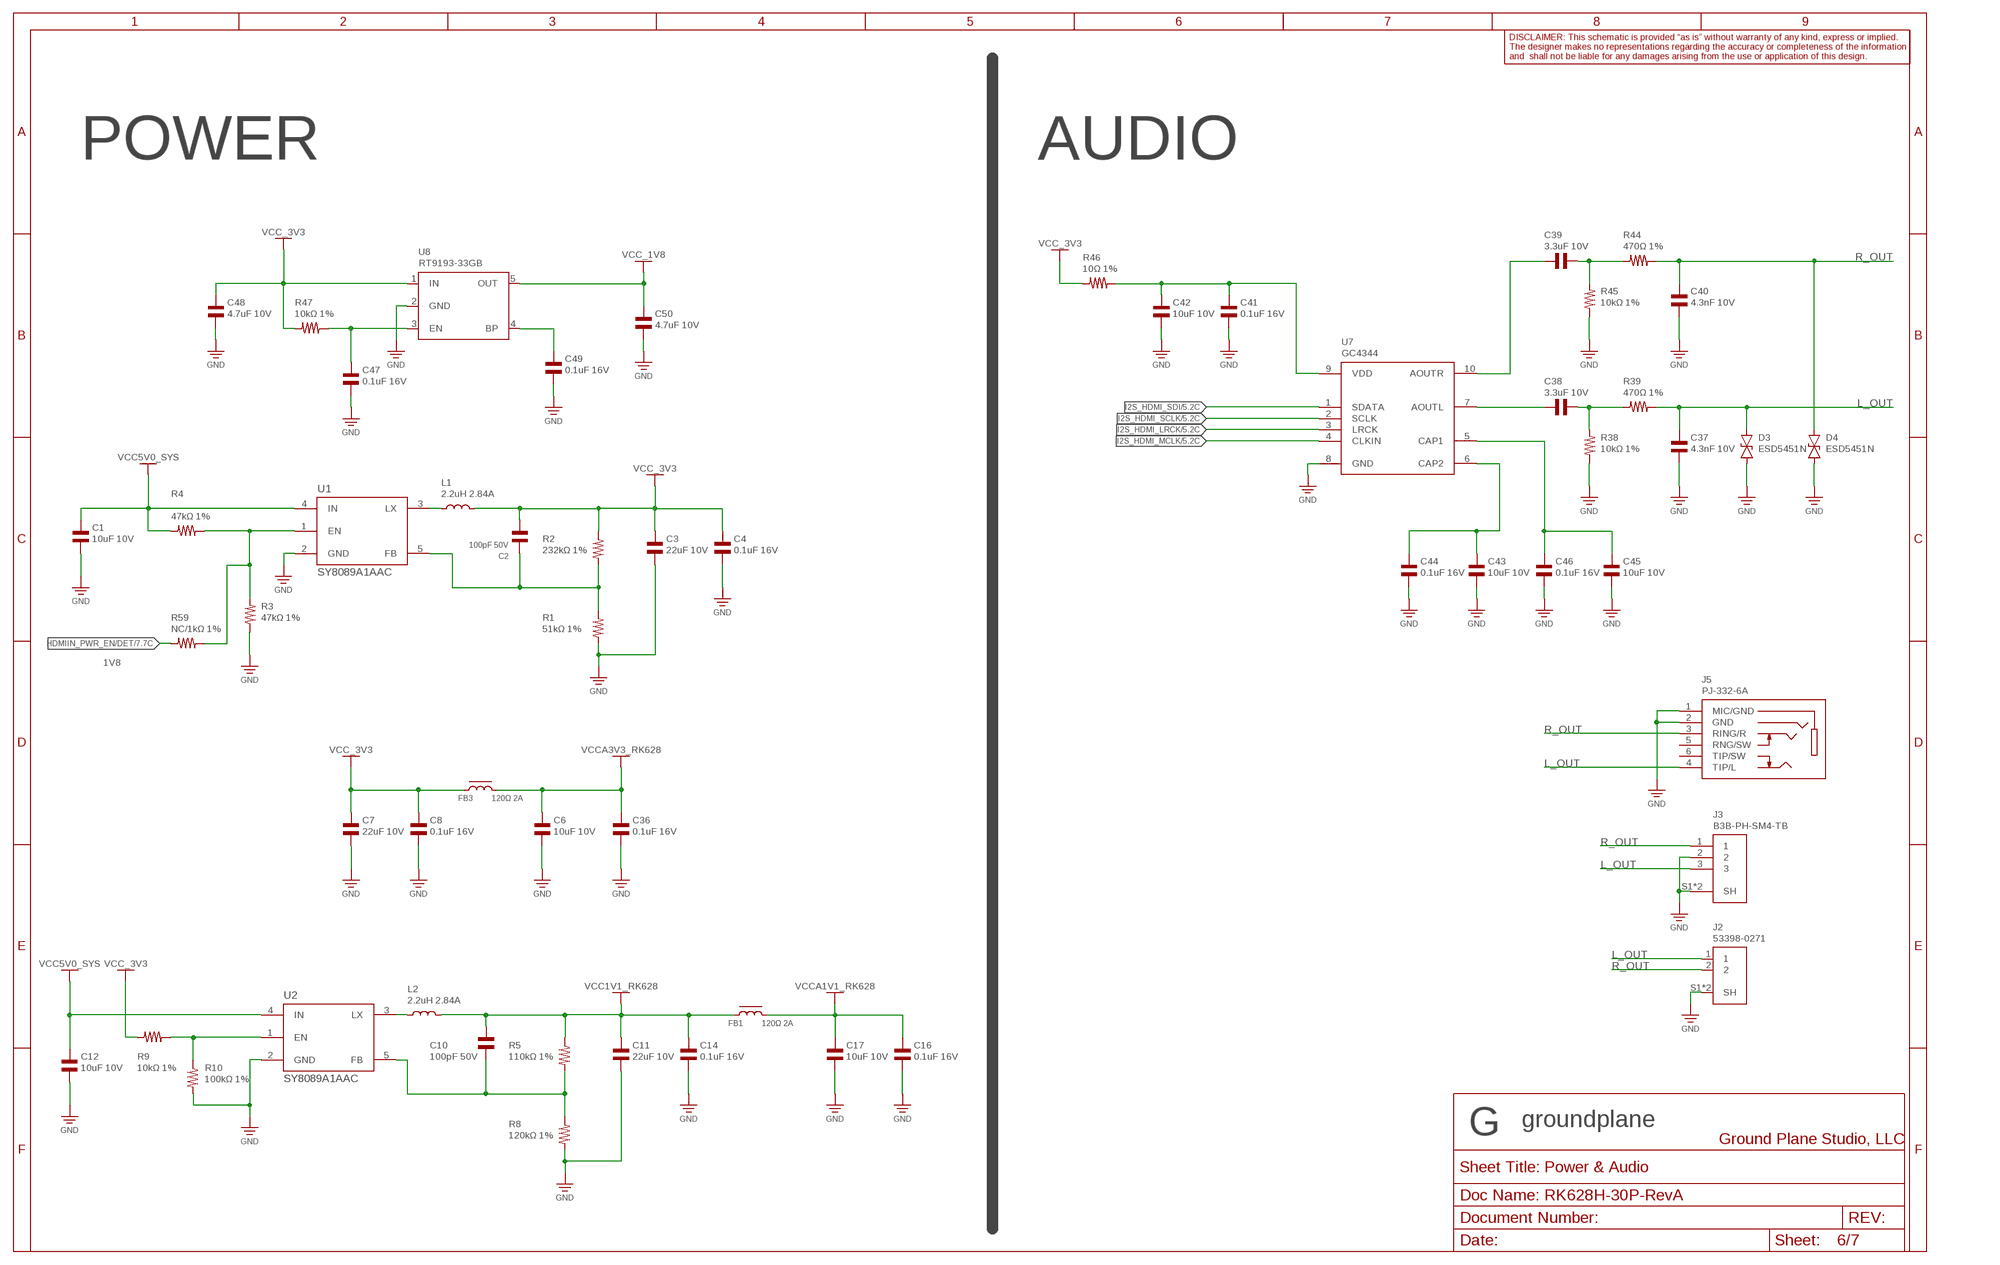
[diagram p6: schematic, sheet 6]

### Parts
C1  10uF 10V  CAP_0402_10UF_10V_X5R  [CAP_0402]
C2  100pF 50V  CAP_0402_100PF_50V_NP0  [CAP_0402]
C3  22uF 10V  CAP_0603_22UF_10V_X5R  [CAP_0603]
C4  0.1uF 16V  CAP_0402_0.1UF_16V_X7R  [CAP_0402]
C6  10uF 10V  CAP_0402_10UF_10V_X5R  [CAP_0402]
C7  22uF 10V  CAP_0603_22UF_10V_X5R  [CAP_0603]
C8  0.1uF 16V  CAP_0402_0.1UF_16V_X7R  [CAP_0402]
C10  100pF 50V  CAP_0402_100PF_50V_NP0  [CAP_0402]
C11  22uF 10V  CAP_0603_22UF_10V_X5R  [CAP_0603]
C12  10uF 10V  CAP_0402_10UF_10V_X5R  [CAP_0402]
C14  0.1uF 16V  CAP_0402_0.1UF_16V_X7R  [CAP_0402]
C16  0.1uF 16V  CAP_0402_0.1UF_16V_X7R  [CAP_0402]
C17  10uF 10V  CAP_0402_10UF_10V_X5R  [CAP_0402]
C36  0.1uF 16V  CAP_0402_0.1UF_16V_X7R  [CAP_0402]
C37  4.3nF 10V  CAP_0402_4.3NF_10V  [CAP_0402]
C38  3.3uF 10V  CAP_0603_3.3UF_10V  [CAP_0603]
C39  3.3uF 10V  CAP_0603_3.3UF_10V  [CAP_0603]
C40  4.3nF 10V  CAP_0402_4.3NF_10V  [CAP_0402]
C41  0.1uF 16V  CAP_0402_0.1UF_16V_X7R  [CAP_0402]
C42  10uF 10V  CAP_0402_10UF_10V_X5R  [CAP_0402]
C43  10uF 10V  CAP_0402_10UF_10V_X5R  [CAP_0402]
C44  0.1uF 16V  CAP_0402_0.1UF_16V_X7R  [CAP_0402]
C45  10uF 10V  CAP_0402_10UF_10V_X5R  [CAP_0402]
C46  0.1uF 16V  CAP_0402_0.1UF_16V_X7R  [CAP_0402]
C47  0.1uF 16V  CAP_0402_0.1UF_16V_X7R  [CAP_0402]
C48  4.7uF 10V  CAP_0402_4.7UF_10V  [CAP_0402]
C49  0.1uF 16V  CAP_0402_0.1UF_16V_X7R  [CAP_0402]
C50  4.7uF 10V  CAP_0402_4.7UF_10V  [CAP_0402]
D3  ESD5451N  TVS_1CH_BI_ESD5451N  [DFN100X60X60-2N]
D4  ESD5451N  TVS_1CH_BI_ESD5451N  [DFN100X60X60-2N]
FB1  120Ω 2A  FERRITE_0603_120R_2A  [IND_0603]
FB3  120Ω 2A  FERRITE_0603_120R_2A  [IND_0603]
J2  53398-0271  CONN_1X02_SH_1.25MM_SM_ST_MX_53398-0271  [CONN_1X02_1.25MM_SM_ST_MX_53398-0271]
J3  B3B-PH-SM4-TB  CONN_1X03_SH_2.0MM_SM_ST_JST_B3B-PH-SM4-TB(LF)(SN)  [CONN_1X03_2.0MM_SM_ST_JST_B3B-PH-SM4-TB(LF)(SN)]
J5  PJ-332-6A  CONN_AUDIO_MIC_JACK_STEREO_SW_3.5MM_SM_RA_PJ_-332-6A  [CONN_JACK_STEREO_SW_3.5MM_SM_RA_PJ-332-6A]
L1  2.2uH 2.84A  IND_3MM_SQ_2.2UH_2.84A_1.2MM_HEIGHT  [IND_3MM_SQ_1.2MM_HEIGHT]
L2  2.2uH 2.84A  IND_3MM_SQ_2.2UH_2.84A_1.2MM_HEIGHT  [IND_3MM_SQ_1.2MM_HEIGHT]
R1  51kΩ 1%  RES_0402_51K_1%  [RES_0402]
R2  232kΩ 1%  RES_0402_232K_1%  [RES_0402]
R3  47kΩ 1%  RES_0402_47K_1%  [RES_0402]
R4  47kΩ 1%  RES_0402_47K_1%  [RES_0402]
R5  110kΩ 1%  RES_0402_110K_1%  [RES_0402]
R8  120kΩ 1%  RES_0402_120K_1%  [RES_0402]
R9  10kΩ 1%  RES_0402_10K_1%_1/16W  [RES_0402]
R10  100kΩ 1%  RES_0402_100K_1%_1/16W  [RES_0402]
R38  10kΩ 1%  RES_0402_10K_1%_1/16W  [RES_0402]
R39  470Ω 1%  RES_0402_470R_1%  [RES_0402]
R44  470Ω 1%  RES_0402_470R_1%  [RES_0402]
R45  10kΩ 1%  RES_0402_10K_1%_1/16W  [RES_0402]
R46  10Ω 1%  RES_0402_10R_1%  [RES_0402]
R47  10kΩ 1%  RES_0402_10K_1%_1/16W  [RES_0402]
R59  NC/1kΩ 1%  RES_0402_DNP_1K_1%  [RES_0402]
U1  SY8089A1AAC  SY8089A1AAC_SY8089A1AAC  [SOT95P285X110-5N]
U2  SY8089A1AAC  SY8089A1AAC_SY8089A1AAC  [SOT95P285X110-5N]
U7  GC4344  DAC_12S_10P_GC4344  [SOP50P490X110-10N]
U8  RT9193-33GB  PWR_REG_LDO_5P_RT9193-33GB  [SOT95P285X110-5N_ROTATED90]

### Nets
GND: C1.1 C3.1 C4.1 C6.1 C7.1 C8.1 C11.1 C12.1 C14.1 C16.1 C17.1 C36.1 C37.2 C40.2 C41.2 C42.2 C43.2 C44.2 C45.2 C46.2 C47.2 C48.2 C49.2 C50.2 D3.2 D4.2 J2.S1(SH) J2.S2(SH) J3.2 J3.S1(SH) J3.S2(SH) J5.1(MIC/GND) J5.2(GND) R1.2 R3.1 R8.2 R10.2 R38.1 R45.1 U1.2(GND) U2.2(GND) U7.8(GND) U8.2(GND) ; also sheet 4,5,7
HDMIIN_PWR_EN/DET: R59.2 ; also sheet 7
I2S_HDMI_LRCK [50 ohm]: U7.3(LRCK) ; also sheet 5
I2S_HDMI_MCLK [50 ohm]: U7.4(CLKIN) ; also sheet 5
I2S_HDMI_SCLK [50 ohm]: U7.2(SCLK) ; also sheet 5
I2S_HDMI_SDI: U7.1(SDATA) ; also sheet 5
L_OUT: C37.1 D3.1 J2.1 J3.3 J5.4(TIP/L) R39.1
N$1: C41.1 C42.1 R46.1 U7.9(VDD)
N$8: C39.1 U7.10(AOUTR)
N$9: C39.2 R44.2 R45.2
N$10: C49.1 U8.4(BP)
N$12: C45.1 C46.1 U7.5(CAP1)
N$13: C43.1 C44.1 U7.6(CAP2)
N$14: C47.1 R47.1 U8.3(EN)
N$17: C38.1 U7.7(AOUTL)
N$19: C2.1 R1.1 R2.2 U1.5(FB)
N$20: R3.2 R4.1 R59.1 U1.1(EN)
N$21: C38.2 R38.2 R39.2
N$23: L2.1 U2.3(LX)
N$120: C10.1 R5.2 R8.1 U2.5(FB)
N$149: L1.1 U1.3(LX)
N$157: R9.1 R10.1 U2.1(EN)
R_OUT: C40.1 D4.1 J2.2 J3.1 J5.3(RING/R) R44.1
VCC1V1_RK628: C10.2 C11.2 C14.2 FB1.1 L2.2 R5.1 ; also sheet 5
VCC5V0_SYS: C1.2 C12.2 R4.2 U1.4(IN) U2.4(IN) ; also sheet 4,7
VCC_1V8: C50.1 U8.5(OUT) ; also sheet 7
VCC_3V3: C2.2 C3.2 C4.2 C7.2 C8.2 C48.1 FB3.1 L1.2 R2.1 R9.2 R46.2 R47.2 U8.1(IN) ; also sheet 4,5,7
VCCA1V1_RK628: C16.2 C17.2 FB1.2 ; also sheet 5
VCCA3V3_RK628: C6.2 C36.2 FB3.2 ; also sheet 5
Unconnected: J5.5(RNG/SW) J5.6(TIP/SW)

### Notes on the sheet
- POWER | AUDIO
- 1V8

## Sheet 7 of 7: FPC Connector, Translators and Holes
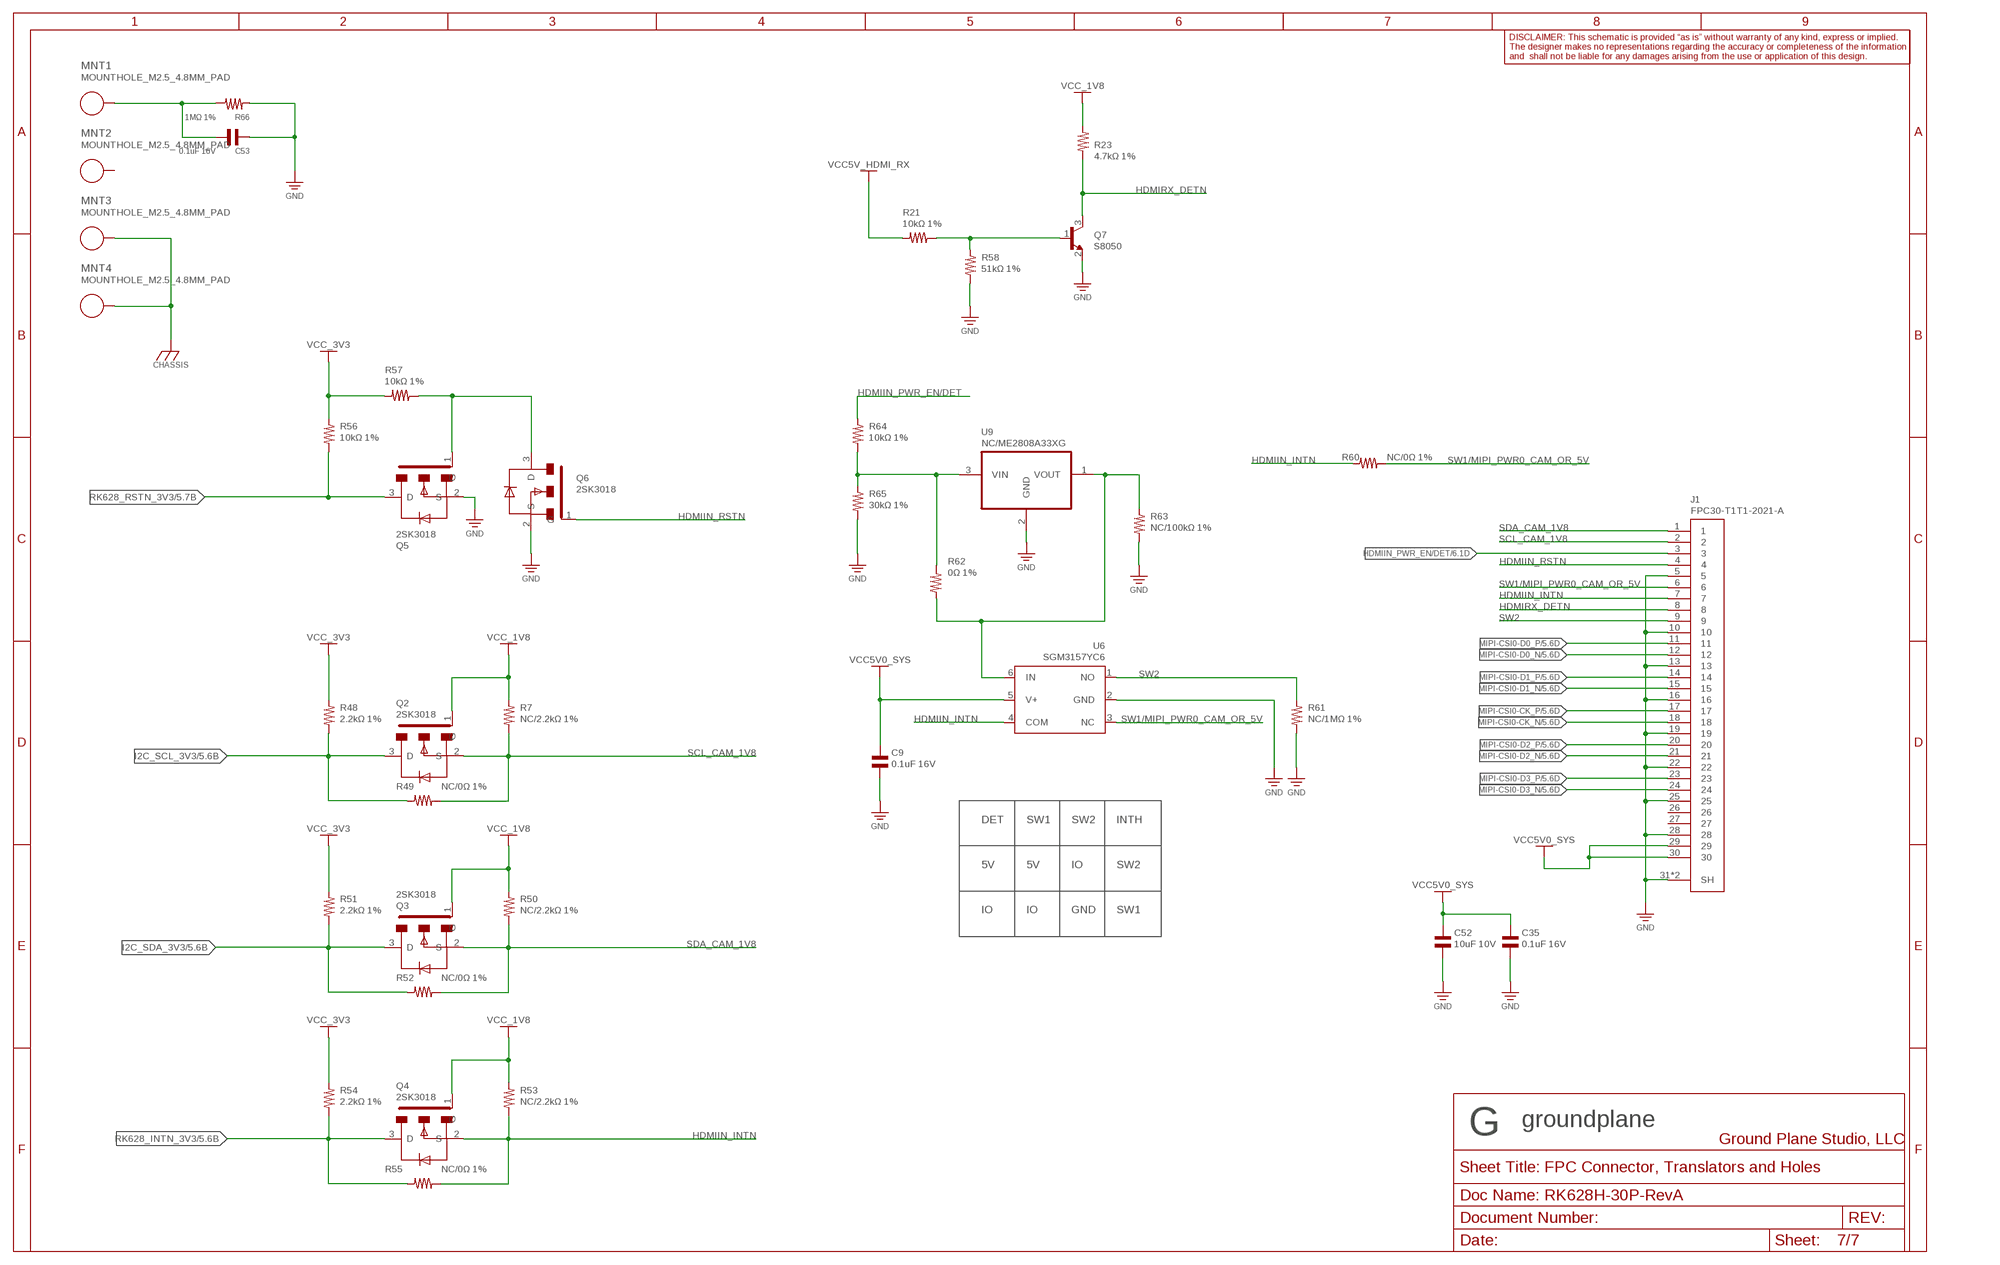
[diagram p7: schematic, sheet 7]

### Parts
C9  0.1uF 16V  CAP_0402_0.1UF_16V_X7R  [CAP_0402]
C35  0.1uF 16V  CAP_0402_0.1UF_16V_X7R  [CAP_0402]
C52  10uF 10V  CAP_0402_10UF_10V_X5R  [CAP_0402]
C53  0.1uF 16V  CAP_0402_0.1UF_16V_X7R  [CAP_0402]
J1  FPC30-T1T1-2021-A  CONN_FFC_1X30_SH_0.5MM_SM_RA_X  [CONN_FFC_1X30_0.5MM_SM_RA_FPC30-T1T1-2021-A]
MNT1  MOUNTHOLE_M2.5_4.8MM_PAD  [MOUNTHOLE_M2.5_4.8MM_PAD]
MNT2  MOUNTHOLE_M2.5_4.8MM_PAD  [MOUNTHOLE_M2.5_4.8MM_PAD]
MNT3  MOUNTHOLE_M2.5_4.8MM_PAD  [MOUNTHOLE_M2.5_4.8MM_PAD]
MNT4  MOUNTHOLE_M2.5_4.8MM_PAD  [MOUNTHOLE_M2.5_4.8MM_PAD]
Q2  2SK3018  FET_N_2SK3018  [SOT-23-3]
Q3  2SK3018  FET_N_2SK3018  [SOT-23-3]
Q4  2SK3018  FET_N_2SK3018  [SOT-23-3]
Q5  2SK3018  FET_N_2SK3018  [SOT-23-3]
Q6  2SK3018  FET_N_2SK3018  [SOT-23-3]
Q7  S8050  NPN_S8050  [SOT-23-3]
R7  NC/2.2kΩ 1%  RES_0402_DNP_2K2_1%  [RES_0402]
R21  10kΩ 1%  RES_0402_10K_1%_1/16W  [RES_0402]
R23  4.7kΩ 1%  RES_0402_4K7_1%  [RES_0402]
R48  2.2kΩ 1%  RES_0402_2K2_1%  [RES_0402]
R49  NC/0Ω 1%  RES_0402_DNP_0R_1%  [RES_0402]
R50  NC/2.2kΩ 1%  RES_0402_DNP_2K2_1%  [RES_0402]
R51  2.2kΩ 1%  RES_0402_2K2_1%  [RES_0402]
R52  NC/0Ω 1%  RES_0402_DNP_0R_1%  [RES_0402]
R53  NC/2.2kΩ 1%  RES_0402_DNP_2K2_1%  [RES_0402]
R54  2.2kΩ 1%  RES_0402_2K2_1%  [RES_0402]
R55  NC/0Ω 1%  RES_0402_DNP_0R_1%  [RES_0402]
R56  10kΩ 1%  RES_0402_10K_1%_1/16W  [RES_0402]
R57  10kΩ 1%  RES_0402_10K_1%_1/16W  [RES_0402]
R58  51kΩ 1%  RES_0402_51K_1%  [RES_0402]
R60  NC/0Ω 1%  RES_0402_DNP_0R_1%  [RES_0402]
R61  NC/1MΩ 1%  RES_0402_DNP_1M_1%  [RES_0402]
R62  0Ω 1%  RES_0402_0R_1%  [RES_0402]
R63  NC/100kΩ 1%  RES_0402_DNP_100K_1%_1/16W  [RES_0402]
R64  10kΩ 1%  RES_0402_10K_1%_1/16W  [RES_0402]
R65  30kΩ 1%  RES_0402_30K_1%  [RES_0402]
R66  1MΩ 1%  RES_0402_1M_1%  [RES_0402]
U6  SGM3157YC6  SWITCH_ANALOG_6P_SGM3157YC6  [SOT65P210X110-6N]
U9  NC/ME2808A33XG  V_DETECTOR_3P_DNP_ME2808A33XG  [SOT-23-3]

### Nets
CGND: MNT3.P$1 MNT4.P$1 ; supply symbol labelled CHASSIS ; also sheet 4
GND: C9.2 C35.2 C52.2 C53.1 J1.5 J1.10 J1.13 J1.16 J1.19 J1.22 J1.25 J1.28 J1.31(SH) J1.32(SH) Q5.2(S) Q6.2(S) Q7.2(E) R58.1 R61.1 R63.1 R65.1 R66.2 U6.2(GND) U9.2(GND) ; also sheet 4,5,6
HDMIIN_INTN: J1.7 Q4.2(S) R53.1 R55.1 R60.2 U6.4(COM)
HDMIIN_PWR_EN/DET: J1.3 R64.2 ; also sheet 6
HDMIIN_RSTN: J1.4 Q6.1(G)
HDMIRX_DETN: J1.8 Q7.3(C) R23.1
I2C_SCL_3V3: Q2.3(D) R48.1 R49.2 ; also sheet 5
I2C_SDA_3V3: Q3.3(D) R51.1 R52.2 ; also sheet 5
MIPI-CSI0-CK_N [hdmi_diff]: J1.18 ; also sheet 5
MIPI-CSI0-CK_P [hdmi_diff]: J1.17 ; also sheet 5
MIPI-CSI0-D0_N [hdmi_diff]: J1.12 ; also sheet 5
MIPI-CSI0-D0_P [hdmi_diff]: J1.11 ; also sheet 5
MIPI-CSI0-D1_N [hdmi_diff]: J1.15 ; also sheet 5
MIPI-CSI0-D1_P [hdmi_diff]: J1.14 ; also sheet 5
MIPI-CSI0-D2_N [hdmi_diff]: J1.21 ; also sheet 5
MIPI-CSI0-D2_P [hdmi_diff]: J1.20 ; also sheet 5
MIPI-CSI0-D3_N [hdmi_diff]: J1.24 ; also sheet 5
MIPI-CSI0-D3_P [hdmi_diff]: J1.23 ; also sheet 5
N$4: Q5.1(G) Q6.3(D) R57.1
N$6: R62.2 R63.2 U6.6(IN) U9.1(VOUT)
N$7: R62.1 R64.1 R65.2 U9.3(VIN)
N$26: C53.2 MNT1.P$1 R66.1
N$44: Q7.1(B) R21.1 R58.2
RK628_INTN_3V3: Q4.3(D) R54.1 R55.2 ; also sheet 5
RK628_RSTN_3V3: Q5.3(D) R56.1 ; also sheet 5
SCL_CAM_1V8: J1.2 Q2.2(S) R7.1 R49.1
SDA_CAM_1V8: J1.1 Q3.2(S) R50.1 R52.1
SW1/MIPI_PWR0_CAM_OR_5V: J1.6 R60.1 U6.3(NC)
SW2: J1.9 R61.2 U6.1(NO)
VCC5V0_SYS: C9.1 C35.1 C52.1 J1.29 J1.30 U6.5(V+) ; also sheet 4,6
VCC5V_HDMI_RX: R21.2 ; also sheet 4
VCC_1V8: Q2.1(G) Q3.1(G) Q4.1(G) R7.2 R23.2 R50.2 R53.2 ; also sheet 6
VCC_3V3: R48.2 R51.2 R54.2 R56.2 R57.2 ; also sheet 4,5,6
Unconnected: J1.26 J1.27 MNT2.P$1

### Notes on the sheet
- DET | SW1 | SW2 | INTH
- 5V | 5V | IO | SW2
- IO | IO | GND | SW1

## Power pins joined to a net without a drawn wire
HDMITX_AVDD_3V3: U3.K4(HDMITX_AVDD_3V3)
HDMITX_DVDD_1V1: U3.J4(HDMITX_DVDD_1V1)
HDMITX_DVDD_1V1_2: U3.J5(HDMITX_DVDD_1V1_2)
HDMITX_DVDD_1V1_3: U3.J6(HDMITX_DVDD_1V1_3)
VCCIO2_1: U3.E8(VCCIO2_1)
VCCIO2_2: U3.F8(VCCIO2_2)

## Library data of the parts
C1 C6 C12 C17 C23 C26 C28 C33 C42 C43 C45 C52 = !GPLIB_PASSIVE:CAP_0402; JLCPCB: C315248; MF: Samsung Electro-Mechanics; MP: CL05A106MP5NUNC
C2 C10 = !GPLIB_PASSIVE:CAP_0402; JLCPCB: C106200; MF: YAGEO; MP: CC0402JRNPO9BN101
C3 C7 C11 = !GPLIB_PASSIVE:CAP_0603; JLCPCB: C7432770; MF: Chinocera; MP: HGC0603R5226M100NTHJ
C4 C5 C8 C9 C14 C16 C18-C20 C25 C27 C29-C32 C34-C36 C41 C44 C46 C47 C49 C51 C53 CH1 = !GPLIB_PASSIVE:CAP_0402; JLCPCB: C1525; JLC_PARTS_TYPE: BASIC; MF: Samsung Electro-Mechanics; MP: CL05B104KO5NNNC
C13 C15 = !GPLIB_PASSIVE:CAP_0402; JLCPCB: C1562; MF: FH (Guangdong Fenghua Advanced Tech); MP: 0402CG330J500NT
C21 C24 = !GPLIB_PASSIVE:CAP_0201
C22 = !GPLIB_PASSIVE:CAP_0402; JLCPCB: C52923; JLC_PARTS_TYPE: Basic; MF: Samsung Electro-Mechanics; MP: CL05A105KA5NQNC
C37 C40 = !GPLIB_PASSIVE:CAP_0402; JLCPCB: C710861
C38 C39 = !GPLIB_PASSIVE:CAP_0603; JLCPCB: C51412
C48 C50 = !GPLIB_PASSIVE:CAP_0402; JLCPCB: C23733; JLC_PARTS_TYPE: Basic; MF: Samsung Electro-Mechanics; MP: CL05A475MP5NRNC
D1 D2 = groundplane:SD103AX; JLCPCB: C20416650; MF: BORN; MP: SD103AX
D3 D4 = !GPLIB_ACTIVE:TVS_1CH_BI; JLCPCB: C2934885; MF: KUU; MP: ESD5451N
ED1-ED4 = !GPLIB_ACTIVE:TVS_ESD_1CH_BI; JLCPCB: C2892490; MF: KUU; MP: KLXES15AAA1
FB1 FB3 = !GPLIB_PASSIVE:FERRITE_0603; JLCPCB: C14709; JLC_FOOTPRINT: TRUE; JLC_PARTS_TYPE: Basic; MF: Murata Electronics; MP: BLM18PG121SN1D
J1 = !GPLIB_CONN:CONN_FFC_1X30_SH; JLC-Y-OFFSET: 0.9525; JLCPCB: C52740867; MF: SHETIME; MP: FPC30-T1T1-2021-A
J2 = !GPLIB_CONN:CONN_1X02_SH; JLC-Y-OFFSET: 0.9525; JLCPCB: C122410; MF: Molex; MP: 53398-0271
J3 = !GPLIB_CONN:CONN_1X03_SH; JLC-ROTATION: 180; JLC-Y-OFFSET: 1.27; JLCPCB: C160353
J4 = !GPLIB_CONN:CONN_HDMI_A; JLC-Y-OFFSET: 2.75; JLCPCB: C7501811; MF: Hong Cheng; MP: HC-HDMI0019T-4
J5 = !GPLIB_CONN:CONN_AUDIO_MIC_JACK_STEREO_SW; JLCPCB: C962626; MF: Korean Hroparts Elec; MP: Korean Hroparts Elec
L1 L2 = !GPLIB_PASSIVE:IND_3MM_SQ; JLCPCB: C404494; MF: TDK; MP: VLS3012HBX-2R2M
L3-L6 = groundplane:BCMF062P120T
MNT1-MNT4 = !GPLIB_PCB:MOUNTHOLE
Q2-Q6 = !GPLIB_ACTIVE:FET_N; JLCPCB: C2681369; MF: Slkor(SLKORMICRO Elec.); MP: 2SK3018
Q7 = !GPLIB_ACTIVE:NPN; JLCPCB: C2146; MF: Jiangsu Changjing Electronics Technology Co., Ltd.; MP: S8050 J3Y(RANGE:200-350)
R1 R58 = !GPLIB_PASSIVE:RES_0402; JLCPCB: C25794; JLC_PARTS_TYPE: Basic; MF: UNI-ROYAL(Uniroyal Elec); MP: 0402WGF5102TCE
R2 = !GPLIB_PASSIVE:RES_0402; JLCPCB: C3013159; MF: FOJAN; MP: FRC0402F2323TS
R3 R4 = !GPLIB_PASSIVE:RES_0402; JLCPCB: C25792; JLC_PARTS_TYPE: Basic; MF: UNI-ROYAL(Uniroyal Elec); MP: 0402WGF4702TCE
R5 = !GPLIB_PASSIVE:RES_0402; JLCPCB: C2909311; MF: FOJAN; MP: FRC0402F1103TS
R6 R32 R33 R36 R37 = !GPLIB_PASSIVE:RES_0402; JLCPCB: C25092; JLC_PARTS_TYPE: Basic; MF: UNI-ROYAL(Uniroyal Elec); MP: 0402WGF220JTCE
R7 R50 R53 = !GPLIB_PASSIVE:RES_0402; JLCPCB: C25879; JLC_PARTS_TYPE: Basic
R8 = !GPLIB_PASSIVE:RES_0402; JLCPCB: C2909314; MF: FOJAN; MP: FRC0402F1203TS
R9 R12 R21 R38 R45 R47 R56 R57 R64 = !GPLIB_PASSIVE:RES_0402; JLCPCB: C2906861; MF: FOJAN; MP: FRC0402F1002TS
R10 R29 = !GPLIB_PASSIVE:RES_0402; JLCPCB: C25741; JLC_PARTS_TYPE: Basic; MF: UNI-ROYAL(Uniroyal Elec); MP: 0402WGF1003TCE
R11 = !GPLIB_PASSIVE:RES_0402; JLCPCB: C324800; MF: FH (Guangdong Fenghua Advanced Tech); MP: RC-02K4021FT
R13-R20 = !GPLIB_PASSIVE:RES_0201; JLCPCB: C270323; MF: UNI-ROYAL(Uniroyal Elec); MP: 0201WMJ022JTEE
R22 R66 = !GPLIB_PASSIVE:RES_0402; JLCPCB: C26083; JLC_PARTS_TYPE: Basic; MF: UNI-ROYAL(Uniroyal Elec); MP: 0402WGF1004TCE
R23 = !GPLIB_PASSIVE:RES_0402; JLCPCB: C105871; MF: YAGEO; MP: RC0402FR-074K7L
R24 R30 R31 R35 = !GPLIB_PASSIVE:RES_0402; JLCPCB: C25076; JLC_PARTS_TYPE: Basic; MF: UNI-ROYAL(Uniroyal Elec); MP: 0402WGF1000TCE
R25 = !GPLIB_PASSIVE:RES_0402; JLCPCB: C138022; MF: YAGEO; MP: RC0402FR-0727KL
R26 R27 = !GPLIB_PASSIVE:RES_0402; JLCPCB: C2909310; MF: FOJAN; MP: FRC0402F1801TS
R28 = !GPLIB_PASSIVE:RES_0402; JLCPCB: C106235; MF: YAGEO; MP: RC0402FR-071KL
R34 = !GPLIB_PASSIVE:RES_0402; JLCPCB: C4109; JLC_PARTS_TYPE: Basic; MF: UNI-ROYAL(Uniroyal Elec); MP: 0402WGF2001TCE
R39 R44 = !GPLIB_PASSIVE:RES_0402; JLCPCB: C25117; JLC_PARTS_TYPE: Basic
R40-R43 = !GPLIB_PASSIVE:RES_0402; JLCPCB: C25105; JLC_PARTS_TYPE: Basic; MF: UNI-ROYAL(Uniroyal Elec); MP: 0402WGF330JTCE
R46 = !GPLIB_PASSIVE:RES_0402; JLCPCB: C25077; JLC_PARTS_TYPE: Basic
R48 R51 R54 = !GPLIB_PASSIVE:RES_0402; JLCPCB: C25879; JLC_PARTS_TYPE: Basic; MF: UNI-ROYAL(Uniroyal Elec); MP: 0402WGF2201TCE
R49 R52 R55 R60 = !GPLIB_PASSIVE:RES_0402; JLCPCB: C17168; JLC_PARTS_TYPE: Basic
R59 = !GPLIB_PASSIVE:RES_0402
R61 = !GPLIB_PASSIVE:RES_0402; JLCPCB: C26083; JLC_PARTS_TYPE: Basic
R62 = !GPLIB_PASSIVE:RES_0402; JLCPCB: C17168; JLC_PARTS_TYPE: Basic; MF: UNI-ROYAL(Uniroyal Elec); MP: 0402WGF0000TCE
R63 = !GPLIB_PASSIVE:RES_0402; JLCPCB: C25741; JLC_PARTS_TYPE: Basic
R65 = !GPLIB_PASSIVE:RES_0402; JLCPCB: C2909347; MP: FRC0402F3002TS
TP1-TP3 = !GPLIB_PCB:TESTPOINT
TP4 = groundplane:TEST_POINT_1MM
U1 U2 = groundplane:SY8089A1AAC; JLC-ROTATION: 180; JLC-X-OFFSET: 0; JLC-Y-OFFSET: 0; JLCPCB: C479074; MF: Silergy Corp; MP: SY8089A1AAC
U3 = !GPLIB_ACTIVE:IF_VIDEO_BRIDGE_RK628F/H; JLCPCB: C45369093; MF: Rockchip; MP: RK628H
U4 U5 = !GPLIB_ACTIVE:TVS_ESD_4CH_10P_PASS_THRU: ESD and Surge protection diodes TVS 4 line bi-directional DFN2510-10; JLCPCB: C42375217; JLC_FOOTPRINT: TRUE; MF: KUU; MP: BTRD10A03
U6 = !GPLIB_ACTIVE:SWITCH_ANALOG_6P; JLCPCB: C46744; MF: SGMICRO; MP: SGM3157YC6/TR
U7 = !GPLIB_ACTIVE:DAC_12S_10P: ESD and Surge protection diodes TVS 4 line bi-directional DFN2510-10; JLC-ROTATION: 180; JLCPCB: C16197182; MF: SX-globalchip; MP: GC4344
U8 = !GPLIB_ACTIVE:PWR_REG_LDO_5P; JLCPCB: C15651; MF: Richtek Tech; MP: RT9193-33GB
U9 = !GPLIB_ACTIVE:V_DETECTOR_3P; JLCPCB: C2925762; MF: MICRONE(Nanjing Micro One Elec); MP: ME2808A33XG
Y5 = groundplane:CRYSTAL_SMD2016-4P; JLCPCB: C20885025; MF: Yajingxin; MP: T201624MLBDE2X

## Net classes
1 ether_diff: width 0.102 mm
2 usb_diff: width 0.147 mm
4 hdmi_diff: width 0.113 mm